# EasyEDA Pro project travellium-12v-desktop-power-supply-cc8d8467.epro, board LM5143_PCB
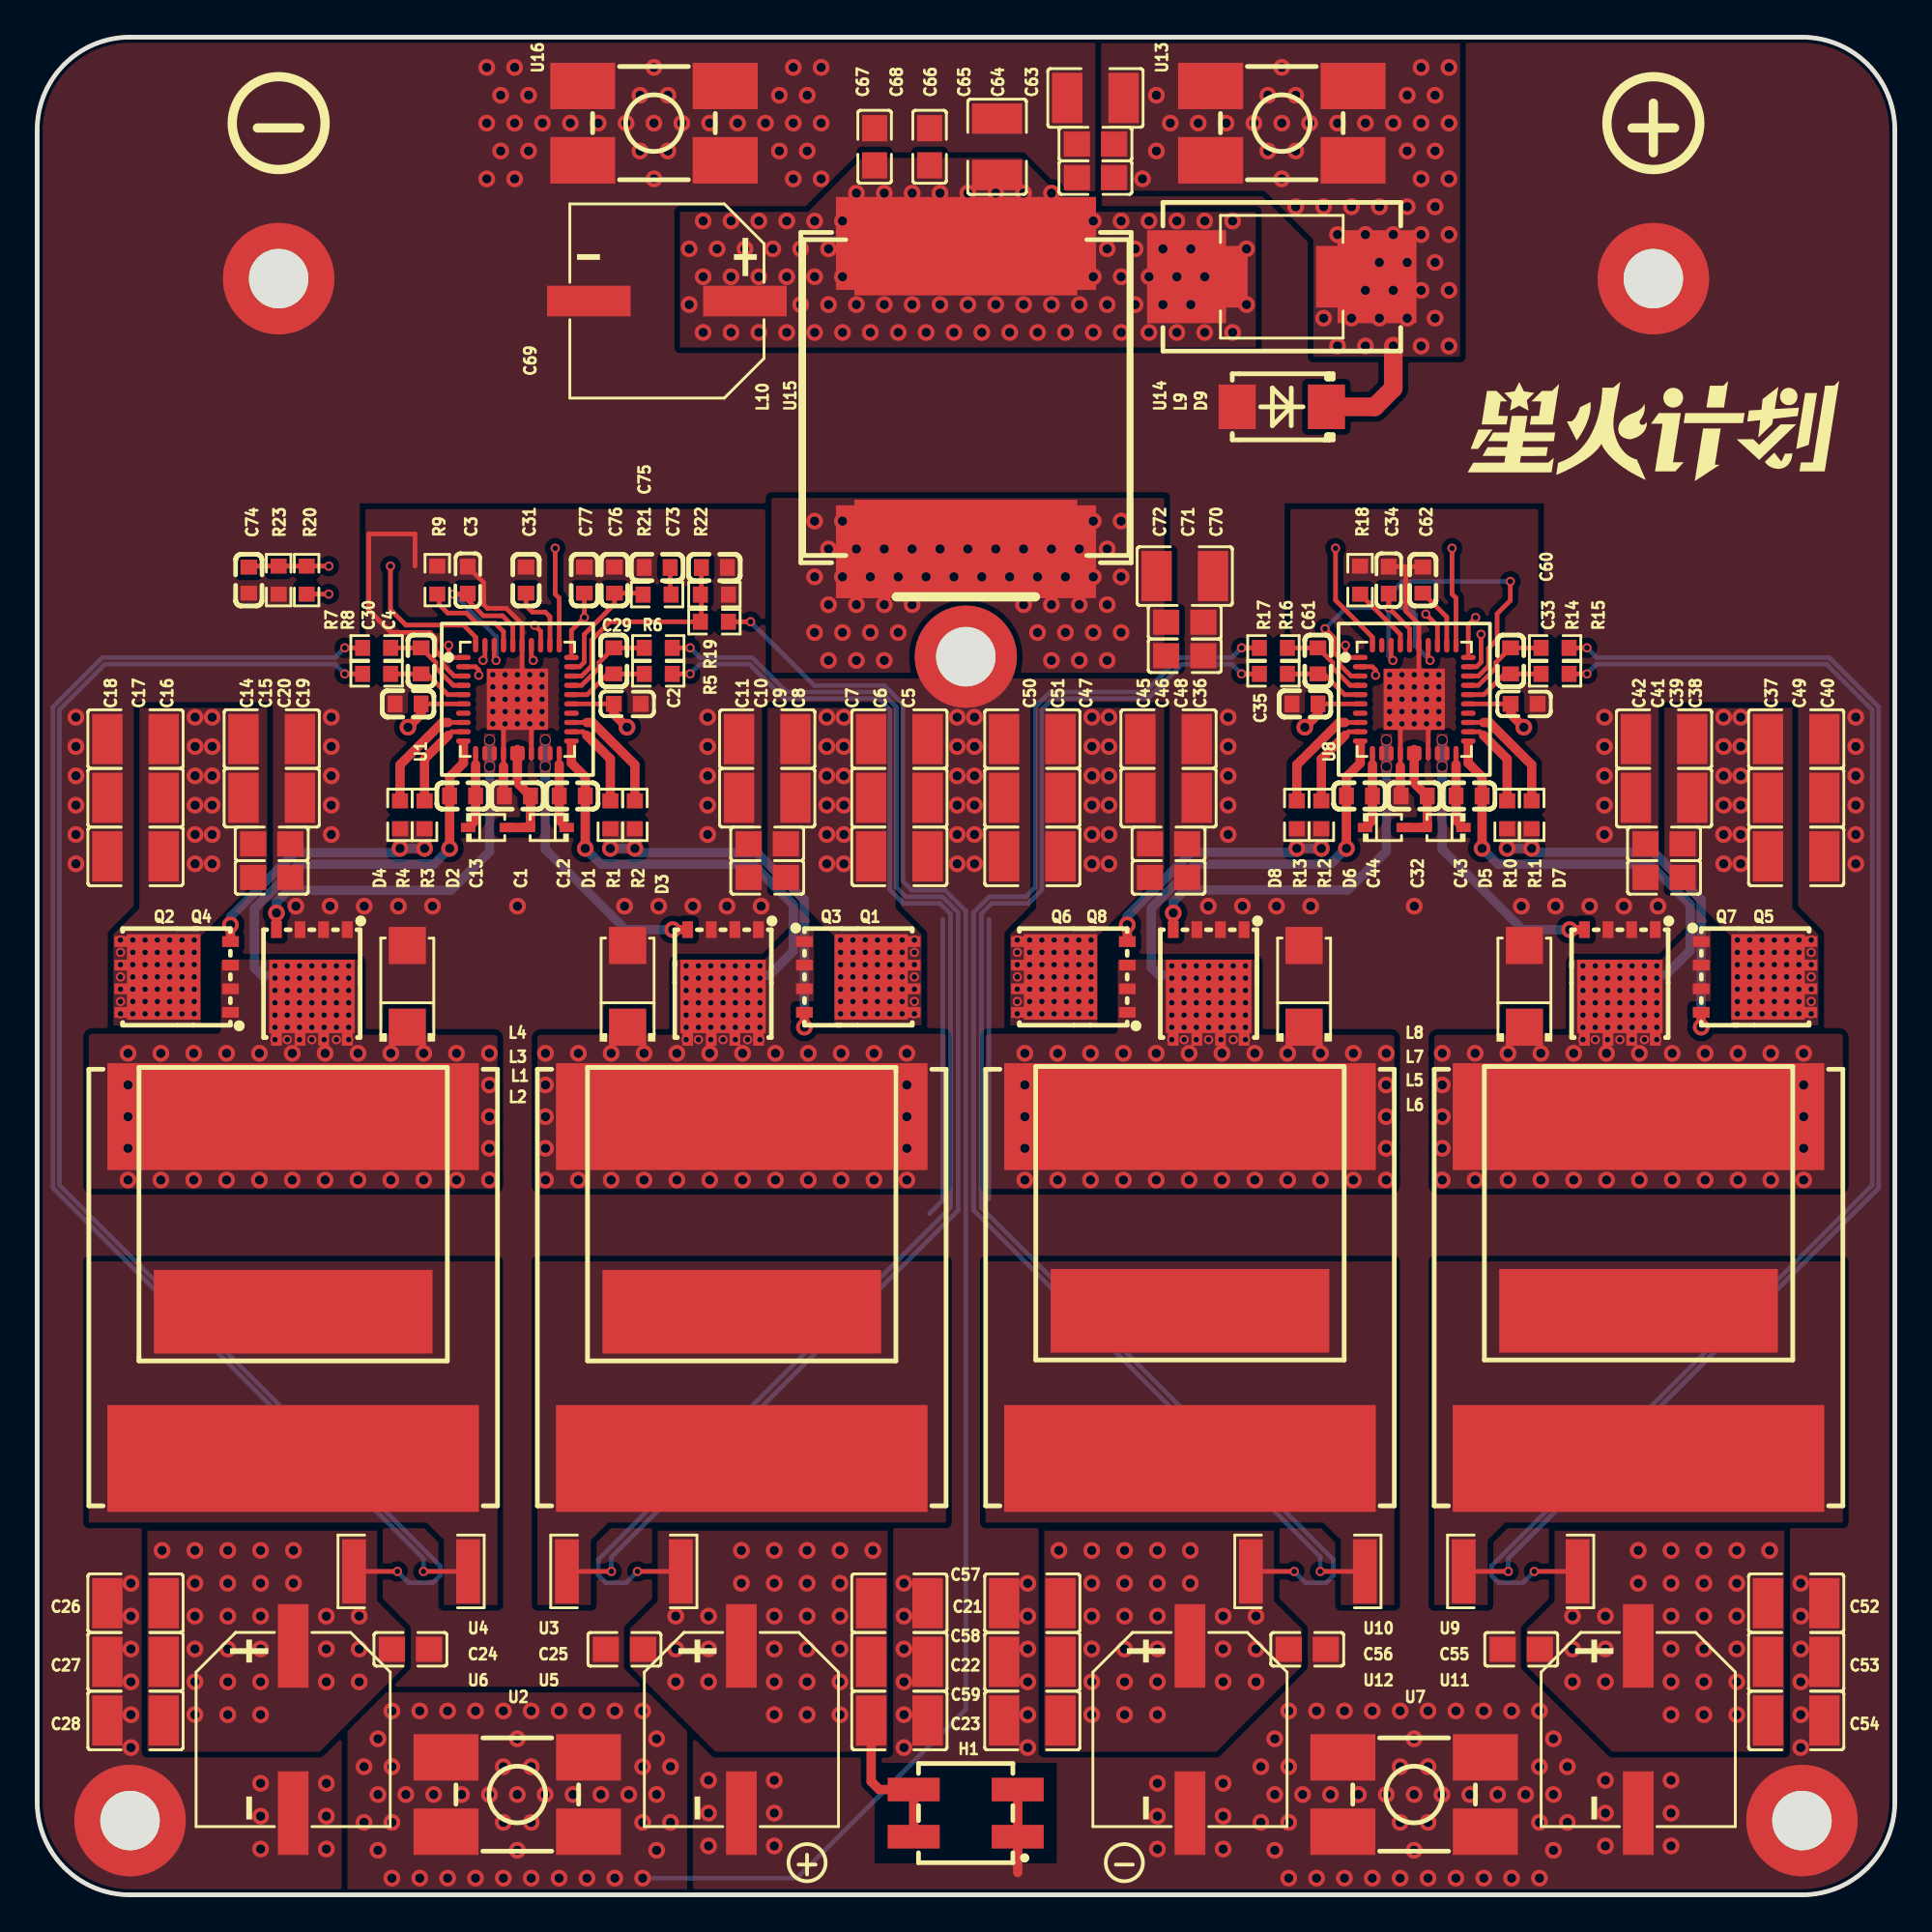
[diagram p7: board, top side]
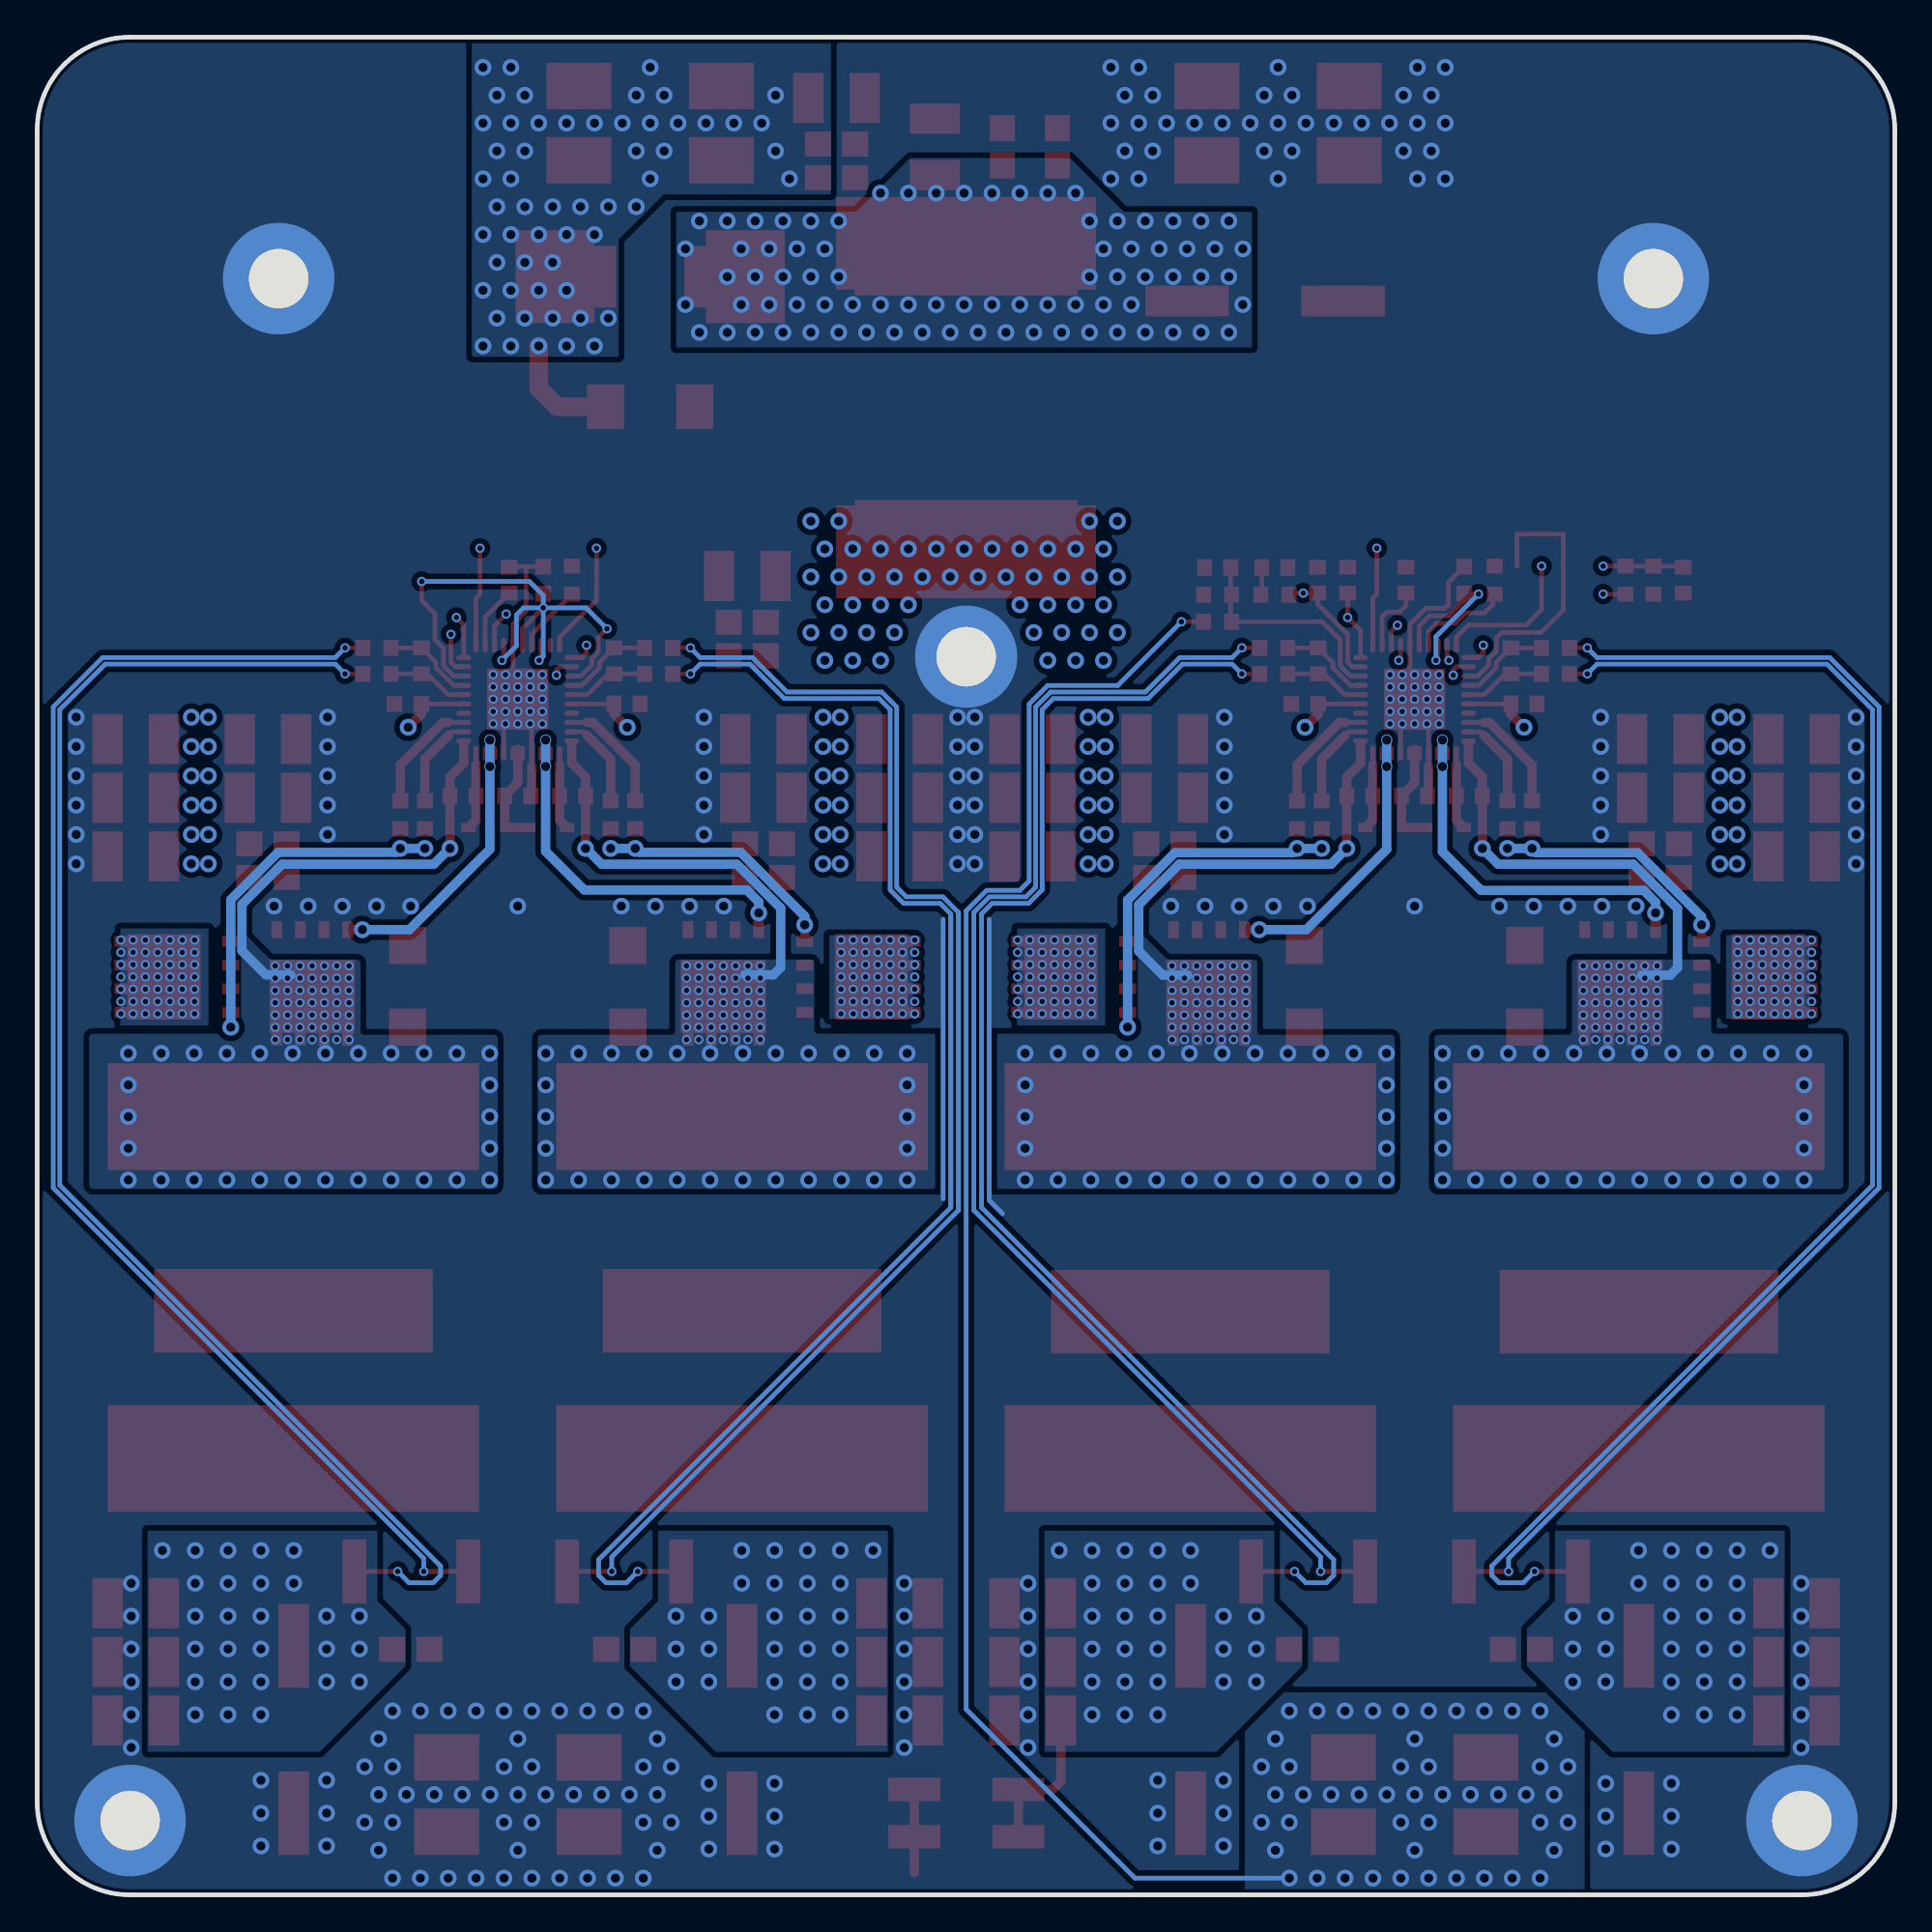
[diagram p8: board, bottom side, seen from below]

Outline 100 x 100 mm; copper layers: Top Layer, Inner1, Inner2, Inner3, Inner4, Bottom Layer. Coordinates in mm from the lower left corner of the outline.
Outline path: 0,95 0,5 arc(1.46,1.46) 5,0 95,0 arc(98.54,1.46) 100,5 100,95 arc(98.54,98.54) 95,100 5,100 arc(1.46,98.54) 0,95
Stack: Top Layer 0.035mm 外层铜厚1oz / Dielectric 2 0.0994mm 3313 RC57% 4.2mil / Inner1 0.0152mm 内层铜厚 / Dielectric3 0.55mm 0.55mm H/H No copper / Inner2 0.0152mm 内层铜厚 / Dielectric 3 0.1088mm 2116 RC54% 4.9mil / Inner3 0.0152mm 内层铜厚 / Dielectric4 0.55mm 0.55mm H/H No copper / Inner4 0.0152mm 内层铜厚 / Dielectric5 0.0994mm 3313 RC57% 4.2mil / Bottom Layer 0.035mm 外层铜厚1oz

## Design rules (mm)
spacing copperThickness1oz (default): track to track 0.1, other pairs 0.15 to 0.3
spacing copperThickness2oz: track to track 0.203, other pairs 0.152 to 0.3
spacing Plane_innerPlane: track to track 0.1, other pairs 0.15 to 0.3
spacing Copper_copperRegion: track to track 0.1, other pairs 0.15 to 0.3
track width copperThickness1oz: min 0.127, default 0.254, max 2.54
track width copperThickness2oz: min 0.203, default 0.254, max 2.54
track width Travellium (default): min 0.1, default 0.2, max 10
differential pair differentialPair (default): width min 0.127, default 0.254, max 2.54; gap min 0.152, default 0.152
pour e1865 uses Copper_copperRegion
pour e1867 uses Copper_copperRegion
pour e1869 uses Copper_copperRegion
pour e1871 uses Copper_copperRegion
pour e1873 uses Copper_copperRegion
pour e1877 uses Copper_copperRegion
pour e1879 uses Copper_copperRegion
pour e1881 uses Copper_copperRegion
pour e1883 uses Copper_copperRegion
pour e1885 uses Copper_copperRegion
pour e1887 uses Copper_copperRegion
pour e1889 uses Copper_copperRegion
pour e1891 uses Copper_copperRegion
pour e1905 uses Copper_copperRegion
pour e1907 uses Copper_copperRegion
pour e1909 uses Copper_copperRegion
pour e1911 uses Copper_copperRegion
pour e1913 uses Copper_copperRegion
pour e1915 uses Copper_copperRegion

## Placement (name value [footprint] x y rotation side)
C1  4.7uF  [C0603]  25.85 59.15 180 top
C2  470nF  [CAP-SMD_L1.6-W0.8-3]  31.77 64.11 180 top
C3  470nF  [CAP-SMD_L1.6-W0.8-3]  23.18 70.77 270 top
C4  2.2uF  [C0603]  19.97 64.11 180 top
C5  10uF  [C1210]  46.41 62.21 180 top
C6  10uF  [C1210]  46.41 59.06 180 top
C7  10uF  [C1210]  46.41 55.9 180 top
C8  10uF  [C1210]  39.3 62.21 0 top
C9  10uF  [C1210]  39.3 59.06 0 top
C10  100nF  [C0805]  39.3 56.58 0 top
C11  10nF  [C0805]  39.3 54.77 180 top
C12  100nF  [C0603]  28.8 59.15 180 top
C13  100nF  [C0603]  22.9 59.15 0 top
C14  10nF  [C0805]  12.63 54.77 0 top
C15  100nF  [C0805]  12.63 56.58 180 top
C16  10uF  [C1210]  5.29 62.21 0 top
C17  10uF  [C1210]  5.29 59.06 0 top
C18  10uF  [C1210]  5.29 55.9 0 top
C19  10uF  [C1210]  12.63 62.21 180 top
C20  10uF  [C1210]  12.63 59.06 180 top
C21  22uF  [C1210]  46.41 15.7 180 top
C22  22uF  [C1210]  46.41 12.54 180 top
C23  22uF  [C1210]  46.41 9.39 180 top
C24  100nF  [C0805]  20.09 13.22 180 top
C25  100nF  [C0805]  31.61 13.22 0 top
C26  22uF  [C1210]  5.29 15.7 0 top
C27  22uF  [C1210]  5.29 12.54 0 top
C28  22uF  [C1210]  5.29 9.39 0 top
C29  33pF  [C0603]  31.04 66.43 270 top
C30  33pF  [C0603]  20.67 66.43 270 top
C31  2.2uF  [C0603]  26.32 70.77 270 top
C32  4.7uF  [C0603]  74.13 59.15 180 top
C33  470nF  [CAP-SMD_L1.6-W0.8-3]  80.04 64.11 180 top
C34  470nF  [CAP-SMD_L1.6-W0.8-3]  72.76 70.77 270 top
C35  2.2uF  [C0603]  68.25 64.11 180 top
C36  10uF  [C1210]  60.9 59.06 180 top
C37  10uF  [C1210]  94.69 55.9 180 top
C38  10uF  [C1210]  87.58 62.21 0 top
C39  10uF  [C1210]  87.58 59.06 0 top
C40  10uF  [C1210]  94.69 62.21 180 top
C41  100nF  [C0805]  87.58 56.58 0 top
C42  10nF  [C0805]  87.58 54.77 180 top
C43  100nF  [C0603]  77.08 59.15 180 top
C44  100nF  [C0603]  71.18 59.15 0 top
C45  10nF  [C0805]  60.9 54.77 0 top
C46  100nF  [C0805]  60.9 56.58 180 top
C47  10uF  [C1210]  53.57 62.21 0 top
C48  10uF  [C1210]  60.9 62.21 180 top
C49  10uF  [C1210]  94.69 59.06 180 top
C50  10uF  [C1210]  53.57 55.9 0 top
C51  10uF  [C1210]  53.57 59.06 0 top
C52  22uF  [C1210]  94.69 15.7 180 top
C53  22uF  [C1210]  94.69 12.54 180 top
C54  22uF  [C1210]  94.69 9.39 180 top
C55  100nF  [C0805]  79.89 13.22 0 top
C56  100nF  [C0805]  68.37 13.22 180 top
C57  22uF  [C1210]  53.57 15.7 0 top
C58  22uF  [C1210]  53.57 12.54 0 top
C59  22uF  [C1210]  53.57 9.39 0 top
C60  33pF  [C0603]  79.32 66.43 270 top
C61  33pF  [C0603]  68.94 66.43 270 top
C62  2.2uF  [C0603]  74.59 70.77 270 top
C63  10uF  [C1210]  56.97 96.73 0 top
C64  100nF  [C0805]  56.97 92.44 0 top
C65  10nF  [C0805]  56.97 94.25 180 top
C66  10uF  [C1210]  51.67 94.1 270 top
C67  100nF  [C0805]  45.08 94.1 270 top
C68  10nF  [C0805]  48.04 94.1 90 top
C69  56uF  [CAP-SMD_BD10.0-L10.3-W10.3-LS11.0-FD-1]  33.9 85.8 180 top
C70  10uF  [C1210]  61.78 70.99 180 top
C71  100nF  [C0805]  61.78 68.51 180 top
C72  10nF  [C0805]  61.78 66.7 0 top
C73  6.8pF  [C0603]  36.46 71.45 180 top
C74  33pF  [C0603]  11.39 70.77 90 top
C75  47nF  [C0603]  33.38 71.45 0 top
C76  220pF  [C0603]  31.08 70.77 270 top
C77  330nF  [C0603]  29.46 70.77 270 top
D1  B5819WS  [SOD-323_L1.7-W1.3-LS2.5-FD]  27.46 57.45 0 top
D2  B5819WS  [SOD-323_L1.7-W1.3-LS2.5-FD]  24.24 57.45 180 top
D3  SS56  [SMA_L4.3-W2.6-LS5.2-RD]  31.78 48.9 90 top
D4  SS56  [SMA_L4.3-W2.6-LS5.2-RD]  19.92 48.9 90 top
D5  B5819WS  [SOD-323_L1.7-W1.3-LS2.5-FD]  75.74 57.45 0 top
D6  B5819WS  [SOD-323_L1.7-W1.3-LS2.5-FD]  72.52 57.45 180 top
D7  SS56  [SMA_L4.3-W2.6-LS5.2-RD]  80.06 48.9 90 top
D8  SS56  [SMA_L4.3-W2.6-LS5.2-RD]  68.2 48.9 90 top
D9  SMBJ58A  [SMB_L4.4-W3.6-LS5.3-RD]  67 80.1 180 top
H1  X6521WVS-2x02H-C60D74  [HDR-SMD_4P-P2.54-V-M-R2-C5-S7.4]  49.98 4.4 90 top
L1  6.8uH  [IND-SMD_L16.5-W15.5]  37.93 36.64 270 top
L2  6.8uH  [IND-SMD_L16.5-W15.5]  13.78 36.64 90 top
L3  6.8uH  [IND-SMD_L23.5-W22.0]  37.93 32.69 270 top
L4  6.8uH  [IND-SMD_L23.5-W22.0]  13.78 32.69 270 top
L5  6.8uH  [IND-SMD_L16.5-W15.5]  86.2 36.69 270 top
L6  6.8uH  [IND-SMD_L16.5-W15.5]  62.06 36.69 90 top
L7  6.8uH  [IND-SMD_L23.5-W22.0]  86.2 32.69 270 top
L8  6.8uH  [IND-SMD_L23.5-W22.0]  62.06 32.69 270 top
L9  150nH  [IND-SMD_L12.8-W8.0_FPIB130840]  67 87.1 180 top
L10  1.5uH  [IND-SMD_L17.5-W17.5]  50 80.6 270 top
NOREF  -  [Pad_e1223]  49.99 66.65 180 top
NOREF#2  -  [Pad_e1227]  95 4 0 top
NOREF#3  -  [Pad_e1224]  13 87 0 top
NOREF#4  -  [Pad_e1225]  87 87 180 top
NOREF#5  -  [Pad_e1226]  5 4 0 top
Q1  CSD18563Q5A  [DFN-8_L5.7-W5.1-P1.27-LS6.0-BL]  44.2 49.41 270 top
Q2  CSD18563Q5A  [DFN-8_L5.7-W5.1-P1.27-LS6.0-BL]  7.51 49.41 90 top
Q3  CSD18563Q5A  [DFN-8_L5.7-W5.1-P1.27-LS6.0-BL]  36.92 49.06 180 top
Q4  CSD18563Q5A  [DFN-8_L5.7-W5.1-P1.27-LS6.0-BL]  14.79 49.06 180 top
Q5  CSD18563Q5A  [DFN-8_L5.7-W5.1-P1.27-LS6.0-BL]  92.48 49.41 270 top
Q6  CSD18563Q5A  [DFN-8_L5.7-W5.1-P1.27-LS6.0-BL]  55.78 49.41 90 top
Q7  CSD18563Q5A  [DFN-8_L5.7-W5.1-P1.27-LS6.0-BL]  85.2 49.06 180 top
Q8  CSD18563Q5A  [DFN-8_L5.7-W5.1-P1.27-LS6.0-BL]  63.06 49.06 180 top
R1  4.7Ω  [R0603]  30.85 58.14 90 top
R2  4.7Ω  [R0603]  32.18 58.14 90 top
R3  4.7Ω  [R0603]  20.85 58.14 270 top
R4  4.7Ω  [R0603]  19.53 58.14 270 top
R5  0Ω  [R0603]  33.44 65.73 0 top
R6  49.9Ω  [R0603]  33.44 67.13 0 top
R7  49.9Ω  [R0603]  18.27 67.13 180 top
R8  0Ω  [R0603]  18.27 65.73 180 top
R9  110kΩ  [R0603]  21.54 70.77 270 top
R10  4.7Ω  [R0603]  79.13 58.14 90 top
R11  4.7Ω  [R0603]  80.45 58.14 90 top
R12  4.7Ω  [R0603]  69.13 58.14 270 top
R13  4.7Ω  [R0603]  67.81 58.14 270 top
R14  0Ω  [R0603]  81.71 65.73 0 top
R15  49.9Ω  [R0603]  81.71 67.13 0 top
R16  49.9Ω  [R0603]  66.55 67.13 180 top
R17  0Ω  [R0603]  66.55 65.73 180 top
R18  110kΩ  [R0603]  71.21 70.77 270 top
R19  130kΩ  [R0603]  36.46 68.53 0 top
R20  220kΩ  [R0603]  14.51 70.77 270 top
R21  33kΩ  [R0603]  33.37 69.99 180 top
R22  6.8kΩ  [R0603]  36.46 69.99 180 top
R23  18kΩ  [R0603]  13 70.77 90 top
U1  LM5143QRHARQ1  [VQFN-40_L6.0-W6.0-P0.50-TL-EP3.3]  25.85 64.36 0 top
U2  TS34031  [CONN-SMD_TS34031]  25.85 5.4 0 top
U3  3mΩ  [R2512]  31.58 17.41 180 top
U4  3mΩ  [R2512]  20.13 17.41 180 top
U5  330uF  [CAP-SMD_BD10.0-L10.3-W10.3-LS10.9-FD]  37.91 8.9 270 top
U6  330uF  [CAP-SMD_BD10.0-L10.3-W10.3-LS10.9-FD]  13.78 8.9 270 top
U7  TS34031  [CONN-SMD_TS34031]  74.12 5.4 0 top
U8  LM5143QRHARQ1  [VQFN-40_L6.0-W6.0-P0.50-TL-EP3.3]  74.13 64.36 0 top
U9  3mΩ  [R2512]  79.86 17.41 180 top
U10  3mΩ  [R2512]  68.4 17.41 180 top
U11  330uF  [CAP-SMD_BD10.0-L10.3-W10.3-LS10.9-FD]  86.19 8.9 270 top
U12  330uF  [CAP-SMD_BD10.0-L10.3-W10.3-LS10.9-FD]  62.06 8.9 270 top
U13  TS34031  [CONN-SMD_TS34031]  67 95.37 0 top
U14  100nH  [IND-SMD_L7.1-W6.6]  67 87.1 180 top
U15  1uH  [IND-SMD_L17.5-W17.0_YXMAC1770]  49.99 80.6 270 top
U16  TS34031  [CONN-SMD_TS34031]  33.2 95.37 0 top

## Footprints (pads in the part's own frame, mm; a bottom-side part is the same pattern mirrored in y, then rotated)
C0603
  rect 0.8x0.9 smd: 1(-0.7,0) 2(0.7,0)
C0805
  rect 1.41x1.35 smd: 1(-1,0) 2(1,0)
C1210
  rect 1.635x2.7 smd: 1(-1.518,0) 2(1.518,0)
CAP-SMD_BD10.0-L10.3-W10.3-LS10.9-FD
  rect 4.5x1.65 smd: 1(-4.5,0) 2(4.5,0)
CAP-SMD_BD10.0-L10.3-W10.3-LS11.0-FD-1
  rect 4.5x1.65 smd: 1(-4.2,0) 2(4.2,0)
CAP-SMD_L1.6-W0.8-3
  rect 0.85x0.85 smd: 1(-0.725,0) 2(0.725,0)
CONN-SMD_TS34031
  rect 3.5x2.5 smd: 1(-3.835,2) 2(-3.835,-2) 3(3.835,-2) 4(3.835,2)
DFN-8_L5.7-W5.1-P1.27-LS6.0-BL
  rect 0.58x0.9 smd: 1(1.905,-2.9) 2(-1.905,-2.9) 2(-0.635,-2.9) 2(0.635,-2.9) 3(-1.905,2.9) 3(-0.635,2.9) 3(0.635,2.9) 3(1.905,2.9)
  rect 4.6x3.95 smd: 3(0,0.695)
HDR-SMD_4P-P2.54-V-M-R2-C5-S7.4
  rect 1.27x2.8 smd: 1(-1.27,-2.8) 2(-1.27,2.8) 3(1.27,-2.8) 4(1.27,2.8)
IND-SMD_L7.1-W6.6
  rect 2.15x3.32 smd: 1(-2.913,0) 2(2.913,0)
IND-SMD_L12.8-W8.0_FPIB130840
  rect 4.25x5 smd: 1(-5.125,0) 2(5.125,0)
IND-SMD_L16.5-W15.5
  rect 4.5x15 smd: 1(5.25,0) 2(-5.25,0)
IND-SMD_L17.5-W17.0_YXMAC1770
  rect 5x12 smd: 1(-8,0) 2(8,0)
IND-SMD_L17.5-W17.5
  rect 5x14 smd: 1(-8.3,0) 2(8.3,0)
IND-SMD_L23.5-W22.0
  rect 5.75x20 smd: 1(-9.2,0) 2(9.2,0)
Pad_e1223
  round 5.5 hole 3.2: 1(0,0)
Pad_e1224
  round 6 hole 3.2: 1(0,0)
Pad_e1225
  round 6 hole 3.2: 1(0,0)
Pad_e1226
  round 6 hole 3.2: 1(0,0)
Pad_e1227
  round 6 hole 3.2: 1(0,0)
R0603
  rect 0.806x0.864 smd: 1(-0.753,0) 2(0.753,0)
R2512
  rect 1.282x3.456 smd: 1(-3.067,0) 2(3.067,0)
SMA_L4.3-W2.6-LS5.2-RD
  rect 2x2 smd: 1(-2.2,0) 2(2.2,0)
SMB_L4.4-W3.6-LS5.3-RD
  rect 2x2.4 smd: 1(-2.4,0) 2(2.4,0)
SOD-323_L1.7-W1.3-LS2.5-FD
  rect 0.78x0.5 smd: 1(-1.04,0) 2(1.04,0)
VQFN-40_L6.0-W6.0-P0.50-TL-EP3.3
  oval 0.79x0.28 smd: 1(-2.908,2.25) 2(-2.908,1.75) 3(-2.908,1.25) 4(-2.908,0.75) 5(-2.908,0.25) 6(-2.908,-0.25) 7(-2.908,-0.75) 8(-2.908,-1.25) 9(-2.908,-1.75) 10(-2.908,-2.25) 21(2.908,-2.25) 22(2.908,-1.75) 23(2.908,-1.25) 24(2.908,-0.75) 25(2.908,-0.25) 26(2.908,0.25) 27(2.908,0.75) 28(2.908,1.25) 29(2.908,1.75) 30(2.908,2.25)
  oval 0.28x0.79 smd: 11(-2.25,-2.908) 12(-1.75,-2.908) 13(-1.25,-2.908) 14(-0.75,-2.908) 15(-0.25,-2.908) 16(0.25,-2.908) 17(0.75,-2.908) 18(1.25,-2.908) 19(1.75,-2.908) 20(2.25,-2.908) 31(2.25,2.908) 32(1.75,2.908) 33(1.25,2.908) 34(0.75,2.908) 35(0.25,2.908) 36(-0.25,2.908) 37(-0.75,2.908) 38(-1.25,2.908) 39(-1.75,2.908) 40(-2.25,2.908)
  rect 3.3x3.3 smd: 41(0,0)

## Nets
As in the schematic, except:
AGND1: C1.2 C2.1 C3.1 C4.2 C5.1 C6.1 C7.1 C8.1 C9.1 C10.1 C11.2 C14.2 C15.1 C16.1 C17.1 C18.1 C19.1 C20.1 C21.1 C22.1 C23.1 C24.1 C25.1 C26.1 C27.1 C28.1 C31.1 C32.2 C33.1 C34.1 C35.2 C36.1 C37.1 C38.1 C39.1 C40.1 C41.1 C42.2 C45.2 C46.1 C47.1 C48.1 C49.1 C50.1 C51.1 C52.1 C53.1 C54.1 C55.1 C56.1 C57.1 C58.1 C59.1 C62.1 C63.1 C64.1 C65.2 C66.1 C67.1 C68.2 C69.2 C70.1 C71.1 C72.2 C73.1 C74.1 C75.1 C76.1 C77.1 D3.2 D4.2 D7.2 D8.2 D9.2 H1.1 H1.3 NOREF.1 NOREF#2.1 NOREF#3.1 NOREF#4.1 NOREF#5.1 Q3.2 Q4.2 Q7.2 Q8.2 R9.1 R18.1 R22.1 R23.1 U1.3 U1.14 U1.17 U1.35 U1.41 U5.2 U6.2 U7.1 U7.2 U7.3 U7.4 U8.14 U8.17 U8.35 U8.41 U11.2 U12.2 U16.1 U16.2 U16.3 U16.4

Pads without a net: U1 7 24; U8 7 24 39

## Via types
v1: diameter 0.5, hole 0.3, Top Layer to Bottom Layer, 484 vias
v2: diameter 0.9, hole 0.5, Top Layer to Bottom Layer, 730 vias
v3: diameter 0.6, hole 0.5, Top Layer to Bottom Layer, 8 vias

## Routing (per net, layer and track width the routed paths; a pad name or vN(x,y) marks a point on that pad's centre or on a via; arc(x,y) is an arc through that point)
AGND1: length 78.3
  Top Layer w0.25: 74.51,65.5 74.38,65.63 U8.35 74.38,68.4 73.68,69.1 73.68,71.5 ; 25.1,60.75 U1.14 25.1,62.95 v1(25.19,63.03) ; v1(73.47,63.03) 73.38,62.95 U8.14 73.38,60.75 ; 20.34,71.53 20.34,73.25 17.85,73.25 17.85,69.15 19.05,67.95 21.15,67.95 21.45,67.65 21.45,66.95 21.85,66.55 21.85,66.21 22.45,65.61 U1.3 ; v1(26.52,63.03) 26.6,62.95 U1.17 ; 73.68,71.5 C34.1 ; 73.68,71.5 74.57,71.5 74.59,71.47 ; 26.23,65.5 26.1,65.63 U1.35 26.1,68.4 25.25,69.25 24.24,69.25 24.04,69.45 24.04,70.64 C3.1 ; v1(74.79,63.03) 74.88,62.95 U8.17
  Top Layer w0.5: 52.78,1.2 H1.1 H1.3 ; 25.1,60.75 25.1,59.2 C1.2 ; C32.2 73.38,59.2 73.38,60.75
  Bottom Layer w0.25: 51.23,37.47 51.23,52.52 ; 48.75,52.52 48.75,37.39 48.04,36.68
  vias: v1(24.53,65.68) v1(24.53,65.02) v1(24.53,64.36) v1(24.53,63.7) v1(24.53,63.03) v1(25.19,65.68) v1(25.19,65.02) v1(25.19,64.36) v1(25.19,63.7) v1(25.85,65.68) v1(25.85,65.02) v1(25.85,64.36) v1(25.85,63.7) v1(25.85,63.03) v1(26.52,65.68) v1(26.52,65.02) v1(26.52,64.36) v1(26.52,63.7) v1(27.18,65.68) v1(27.18,65.02) v1(27.18,64.36) v1(27.18,63.7) v1(27.18,63.03) v1(72.81,65.68) v1(72.81,65.02) v1(72.81,64.36) v1(72.81,63.7) v1(72.81,63.03) v1(73.47,65.68) v1(73.47,65.02) v1(73.47,64.36) v1(73.47,63.7) v1(74.13,65.68) v1(74.13,65.02) v1(74.13,64.36) v1(74.13,63.7) v1(74.13,63.03) v1(74.79,65.68) v1(74.79,65.02) v1(74.79,64.36) v1(74.79,63.7) v1(75.45,65.68) v1(75.45,65.02) v1(75.45,64.36) v1(75.45,63.7) v1(75.45,63.03) v2(2.09,63.39) v2(2.09,61.81) v2(2.09,60.24) v2(2.09,58.66) v2(2.09,57.08) v2(2.09,55.5) v2(5.05,16.77) v2(5.05,15) v2(5.05,13.23) v2(5.05,11.47) v2(5.05,9.7) v2(5.05,7.93) v2(12.03,6) v2(12.03,4.23) v2(12.03,2.47) v2(13.93,53.22) v2(15.57,6) v2(15.57,4.23) v2(15.57,2.47) v2(15.83,63.39) v2(15.83,61.81) v2(15.83,60.24) v2(15.83,58.66) v2(15.83,57.08) v2(15.77,53.22) v2(17.61,53.22) v2(19.44,53.22) v2(21.28,53.22) v2(24.2,98.37) v2(24.2,95.37) v2(24.2,92.37) v2(24.95,96.87) v2(24.95,93.87) v2(25.7,98.37) v2(25.7,95.37) v2(25.7,92.37) v2(25.85,53.22) v2(26.45,96.87) v2(26.45,93.87) v2(27.2,95.37) v2(28.7,95.37) v2(30.2,95.37) v2(31.62,53.22) v2(31.7,95.37) v2(32.45,96.87) v2(32.45,93.87) v2(33.2,98.37) v2(33.2,95.37) v2(33.2,92.37) v2(33.46,53.22) v2(33.95,96.87) v2(33.95,93.87) v2(34.7,95.37) v2(35.3,53.22) v2(36.09,63.39) v2(36.09,61.81) v2(36.09,60.24) v2(36.09,58.66) v2(36.09,57.08) v2(36.14,6.17) v2(36.14,4.4) v2(36.14,2.63) v2(36.2,95.37) v2(37.13,53.22) v2(37.7,95.37) v2(38.97,53.22) v2(39.2,95.37) v2(39.68,6.17) v2(39.68,4.4) v2(39.68,2.63) v2(39.95,96.87) v2(39.95,93.87) v2(40.7,98.37) v2(40.7,95.37) v2(40.7,92.37) v2(41.45,96.87) v2(41.45,93.87) v2(42.2,98.37) v2(42.2,95.37) v2(42.2,92.37) v2(46.66,16.77) v2(46.66,15) v2(46.66,13.23) v2(46.66,11.47) v2(46.66,9.7) v2(46.66,7.93) v2(49.53,63.39) v2(49.53,61.81) v2(49.53,60.24) v2(49.53,58.66) v2(49.53,57.08) v2(49.53,55.5) v2(50.46,63.39) v2(50.46,61.81) v2(50.46,60.24) v2(50.46,58.66) v2(50.46,57.08) v2(50.46,55.5) v2(53.32,16.77) v2(53.32,15) v2(53.32,13.23) v2(53.32,11.47) v2(53.32,9.7) v2(53.32,7.93) v2(60.3,6) v2(60.3,4.23) v2(60.3,2.47) v2(63.04,53.22) v2(63.84,6) v2(63.84,4.23) v2(63.84,2.47) v2(64.11,63.39) v2(64.11,61.81) v2(64.11,60.24) v2(64.11,58.66) v2(64.11,57.08) v2(64.88,53.22) v2(65.87,6.9) v2(65.87,3.9) v2(66.62,8.4) v2(66.62,5.4) v2(66.62,2.4) v2(66.72,53.22) v2(67.37,9.9) v2(67.37,6.9) v2(67.37,3.9) v2(67.37,0.9) v2(68.12,5.4) v2(68.56,53.22) v2(68.87,9.9) v2(68.87,0.9) v2(69.62,5.4) v2(70.37,9.9) v2(70.37,0.9) v2(71.12,5.4) v2(71.87,9.9) v2(71.87,0.9) v2(72.62,5.4) v2(73.37,9.9) v2(73.37,6.9) v2(73.37,3.9) v2(73.37,0.9) v2(74.13,53.22) v2(74.12,8.4) v2(74.12,5.4) v2(74.12,2.4) v2(74.87,9.9) v2(74.87,6.9) v2(74.87,3.9) v2(74.87,0.9) v2(75.62,5.4) v2(76.37,9.9) v2(76.37,0.9) v2(77.12,5.4) v2(77.87,9.9) v2(77.87,0.9) v2(78.62,5.4) v2(79.37,9.9) v2(79.37,0.9) v2(79.9,53.22) v2(80.12,5.4) v2(80.87,9.9) v2(80.87,6.9) v2(80.87,3.9) v2(80.87,0.9) v2(81.62,8.4) v2(81.62,5.4) v2(81.62,2.4) v2(81.73,53.22) v2(82.37,6.9) v2(82.37,3.9) v2(83.57,53.22) v2(84.37,63.39) v2(84.37,61.81) v2(84.37,60.24) v2(84.37,58.66) v2(84.37,57.08) v2(84.42,6.17) v2(84.42,4.4) v2(84.42,2.63) v2(85.41,53.22) v2(87.25,53.22) v2(87.95,6.17) v2(87.95,4.4) v2(87.95,2.63) v2(94.94,16.77) v2(94.94,15) v2(94.94,13.23) v2(94.94,11.47) v2(94.94,9.7) v2(94.94,7.93) v2(97.9,63.39) v2(97.9,61.81) v2(97.9,60.24) v2(97.9,58.66) v2(97.9,57.08) v2(97.9,55.5)
P5V: length 72.4
  Top Layer w0.25: C4.1 U1.6 ; 68.94,64.11 U8.6
  Top Layer w0.5: v2(68.24,62.85) 68.95,63.56 C35.1 ; v2(19.96,62.85) 20.67,63.56 20.67,64.11
  Inner4 w0.5: v2(19.96,62.85) 23.32,59.5 28.2,59.5 29.1,60.4 29.1,63.2 41.2,75.3 58.8,75.3 68.24,65.86 v2(68.24,62.85)
VCC1: length 5.7
  Top Layer w0.5: 25.85,61.65 25.85,59.88 25.96,59.77 25.96,59.75 C1.1 26.55,57.58 D1.1 25.28,57.45
VCC2: length 5.7
  Top Layer w0.5: D6.1 D5.1 74.83,57.58 C32.1 74.23,59.75 74.23,59.77 74.13,59.88 74.13,61.65
VDDA1: length 19.6
  Top Layer w0.25: v1(24.7,66.45) 24.6,66.55 U1.38 ; U1.34 26.6,66.55 v1(26.7,66.45) ; U1.33 27.1,68.02 v1(26.78,68.34) ; U1.36 25.6,68.3 25.05,68.85 24.02,68.85 23.18,69.69 C3.2 23.15,70.02 v1(22.41,70.02)
  Inner3 w0.5: v1(26.7,66.45) 26.78,66.53 v1(26.78,68.34) 25.1,70.02 v1(22.41,70.02)
  Bottom Layer w0.25: v1(24.7,66.45) 24.7,67.73 v1(22.41,70.02)
VDDA2: length 33.6
  Top Layer w0.25: v1(72.98,66.45) 72.88,66.55 U8.38 ; U8.3 70.73,65.61 70.13,66.21 70.13,66.55 69.8,66.88 69.8,67.68 v1(69.33,68.15) ; U8.28 77.58,65.61 78.13,66.15 78.13,67.11 78.59,67.57 78.59,68.96 79.3,69.67 v1(79.3,70.7) ; C34.2 v1(72.76,69.28) 73.88,68.16 U8.36 ; v1(74.98,66.45) 74.88,66.55 U8.34
  Bottom Layer w0.25: v1(72.76,69.28) 72.76,69.96 73.5,70.7 v1(79.3,70.7) ; v1(72.76,69.28) 70.45,69.28 v1(69.33,68.15) ; v1(72.76,69.28) 72.76,66.68 v1(72.98,66.45) ; v1(72.76,69.28) 73.82,69.28 74.2,68.9 74.2,67.23 v1(74.98,66.45)
VIN: length 43.3
  Top Layer w0.25: U8.25 C33.2 ; 14.51,70.02 v1(15.7,70.02) ; U1.25 C2.2
  Top Layer w0.5: C2.2 31.04,63.56 v2(31.75,62.85) ; C33.2 79.32,63.56 v2(80.03,62.85)
  Inner4 w0.5: v2(31.75,62.85) 33.6,64.7 41.2,64.7 v2(42.51,63.39) ; v2(90.78,63.39) 89.48,64.7 81.87,64.7 v2(80.03,62.85) ; v2(9.42,63.39) 9.42,65.62 13.82,70.02 v1(15.7,70.02)
  vias: v1(4.49,51.4) v1(4.49,50.74) v1(4.49,50.07) v1(4.49,49.41) v1(4.49,48.75) v1(4.49,48.09) v1(4.49,47.43) v1(5.15,51.4) v1(5.15,50.74) v1(5.15,50.07) v1(5.15,49.41) v1(5.15,48.75) v1(5.15,48.09) v1(5.15,47.43) v1(5.81,51.4) v1(5.81,50.74) v1(5.81,50.07) v1(5.81,49.41) v1(5.81,48.75) v1(5.81,48.09) v1(5.81,47.43) v1(6.47,51.4) v1(6.47,50.74) v1(6.47,50.07) v1(6.47,49.41) v1(6.47,48.75) v1(6.47,48.09) v1(6.47,47.43) v1(7.13,51.4) v1(7.13,50.74) v1(7.13,50.07) v1(7.13,49.41) v1(7.13,48.75) v1(7.13,48.09) v1(7.13,47.43) v1(7.8,51.4) v1(7.8,50.74) v1(7.8,50.07) v1(7.8,49.41) v1(7.8,48.75) v1(7.8,48.09) v1(7.8,47.43) v1(8.46,51.4) v1(8.46,50.74) v1(8.46,50.07) v1(8.46,49.41) v1(8.46,48.75) v1(8.46,48.09) v1(8.46,47.43) v1(43.25,51.4) v1(43.25,50.74) v1(43.25,50.07) v1(43.25,49.41) v1(43.25,48.75) v1(43.25,48.09) v1(43.25,47.43) v1(43.91,51.4) v1(43.91,50.74) v1(43.91,50.07) v1(43.91,49.41) v1(43.91,48.75) v1(43.91,48.09) v1(43.91,47.43) v1(44.57,51.4) v1(44.57,50.74) v1(44.57,50.07) v1(44.57,49.41) v1(44.57,48.75) v1(44.57,48.09) v1(44.57,47.43) v1(45.24,51.4) v1(45.24,50.74) v1(45.24,50.07) v1(45.24,49.41) v1(45.24,48.75) v1(45.24,48.09) v1(45.24,47.43) v1(45.9,51.4) v1(45.9,50.74) v1(45.9,50.07) v1(45.9,49.41) v1(45.9,48.75) v1(45.9,48.09) v1(45.9,47.43) v1(46.56,51.4) v1(46.56,50.74) v1(46.56,50.07) v1(46.56,49.41) v1(46.56,48.75) v1(46.56,48.09) v1(46.56,47.43) v1(47.22,51.4) v1(47.22,50.74) v1(47.22,50.07) v1(47.22,49.41) v1(47.22,48.75) v1(47.22,48.09) v1(47.22,47.43) v1(52.76,51.4) v1(52.76,50.74) v1(52.76,50.07) v1(52.76,49.41) v1(52.76,48.75) v1(52.76,48.09) v1(52.76,47.43) v1(53.42,51.4) v1(53.42,50.74) v1(53.42,50.07) v1(53.42,49.41) v1(53.42,48.75) v1(53.42,48.09) v1(53.42,47.43) v1(54.09,51.4) v1(54.09,50.74) v1(54.09,50.07) v1(54.09,49.41) v1(54.09,48.75) v1(54.09,48.09) v1(54.09,47.43) v1(54.75,51.4) v1(54.75,50.74) v1(54.75,50.07) v1(54.75,49.41) v1(54.75,48.75) v1(54.75,48.09) v1(54.75,47.43) v1(55.41,51.4) v1(55.41,50.74) v1(55.41,50.07) v1(55.41,49.41) v1(55.41,48.75) v1(55.41,48.09) v1(55.41,47.43) v1(56.07,51.4) v1(56.07,50.74) v1(56.07,50.07) v1(56.07,49.41) v1(56.07,48.75) v1(56.07,48.09) v1(56.07,47.43) v1(56.73,51.4) v1(56.73,50.74) v1(56.73,50.07) v1(56.73,49.41) v1(56.73,48.75) v1(56.73,48.09) v1(56.73,47.43) v1(91.53,51.4) v1(91.53,50.74) v1(91.53,50.07) v1(91.53,49.41) v1(91.53,48.75) v1(91.53,48.09) v1(91.53,47.43) v1(92.19,51.4) v1(92.19,50.74) v1(92.19,50.07) v1(92.19,49.41) v1(92.19,48.75) v1(92.19,48.09) v1(92.19,47.43) v1(92.85,51.4) v1(92.85,50.74) v1(92.85,50.07) v1(92.85,49.41) v1(92.85,48.75) v1(92.85,48.09) v1(92.85,47.43) v1(93.51,51.4) v1(93.51,50.74) v1(93.51,50.07) v1(93.51,49.41) v1(93.51,48.75) v1(93.51,48.09) v1(93.51,47.43) v1(94.17,51.4) v1(94.17,50.74) v1(94.17,50.07) v1(94.17,49.41) v1(94.17,48.75) v1(94.17,48.09) v1(94.17,47.43) v1(94.84,51.4) v1(94.84,50.74) v1(94.84,50.07) v1(94.84,49.41) v1(94.84,48.75) v1(94.84,48.09) v1(94.84,47.43) v1(95.5,51.4) v1(95.5,50.74) v1(95.5,50.07) v1(95.5,49.41) v1(95.5,48.75) v1(95.5,48.09) v1(95.5,47.43) v2(8.5,63.39) v2(8.5,61.81) v2(8.5,60.24) v2(8.5,58.66) v2(8.5,57.08) v2(8.5,55.5) v2(9.42,61.81) v2(9.42,60.24) v2(9.42,58.66) v2(9.42,57.08) v2(9.42,55.5) v2(41.85,73.95) v2(41.85,70.95) v2(41.85,67.95) v2(42.51,61.81) v2(42.51,60.24) v2(42.51,58.66) v2(42.51,57.08) v2(42.51,55.5) v2(42.6,72.45) v2(42.6,69.45) v2(42.6,66.45) v2(43.35,73.95) v2(43.35,70.95) v2(43.35,67.95) v2(43.43,63.39) v2(43.43,61.81) v2(43.43,60.24) v2(43.43,58.66) v2(43.43,57.08) v2(43.43,55.5) v2(44.1,72.45) v2(44.1,69.45) v2(44.1,66.45) v2(44.85,70.95) v2(44.85,67.95) v2(45.6,72.45) v2(45.6,69.45) v2(45.6,66.45) v2(46.35,70.95) v2(46.35,67.95) v2(47.1,72.45) v2(47.1,69.45) v2(47.85,70.95) v2(48.6,72.45) v2(49.35,70.95) v2(50.1,72.45) v2(50.85,70.95) v2(51.6,72.45) v2(52.35,70.95) v2(53.1,72.45) v2(53.1,69.45) v2(53.85,70.95) v2(53.85,67.95) v2(54.6,72.45) v2(54.6,69.45) v2(54.6,66.45) v2(55.35,70.95) v2(55.35,67.95) v2(56.1,72.45) v2(56.1,69.45) v2(56.1,66.45) v2(56.85,73.95) v2(56.85,70.95) v2(56.85,67.95) v2(56.78,63.39) v2(56.78,61.81) v2(56.78,60.24) v2(56.78,58.66) v2(56.78,57.08) v2(56.78,55.5) v2(57.6,72.45) v2(57.6,69.45) v2(57.6,66.45) v2(57.7,63.39) v2(57.7,61.81) v2(57.7,60.24) v2(57.7,58.66) v2(57.7,57.08) v2(57.7,55.5) v2(58.35,73.95) v2(58.35,70.95) v2(58.35,67.95) v2(90.78,61.81) v2(90.78,60.24) v2(90.78,58.66) v2(90.78,57.08) v2(90.78,55.5) v2(91.7,63.39) v2(91.7,61.81) v2(91.7,60.24) v2(91.7,58.66) v2(91.7,57.08) v2(91.7,55.5)
COMP: length 85.9
  Top Layer w0.25: R21.2 32.54,70.07 v1(31.84,70.07) C76.2 31.08,69.48 29.45,67.85 29.45,66.35 29.21,66.11 U1.29 ; v1(77.73,67.85) 77.73,66.35 77.48,66.11 U8.29 ; v1(72.05,65.65) 72.05,65.93 71.87,66.11 U8.2 ; U1.2 23.6,66.11 23.77,65.93 v1(23.77,65.65)
  Inner4 w0.5: v1(23.77,65.65) 23.1,66.33 23.1,67.1 25,69 27.8,69 28.8,68 29.77,68 v1(31.84,70.07) 39.07,77.3 62.3,77.3 68.3,71.3 76.8,71.3 78.38,69.72 78.38,68.51 v1(77.73,67.85) 77.27,67.4 72.8,67.4 72.05,66.65 v1(72.05,65.65)
FB1: length 11.9
  Top Layer w0.25: U1.28 29.31,65.61 29.85,66.15 29.85,67.55 30.83,68.53 R19.1 35.76,68.58 C73.2
SS: length 74
  Top Layer w0.25: v1(77.43,68.76) 77.04,68.36 U8.30 ; v1(22.15,67.27) 22.15,66.85 22.4,66.61 U1.1 ; U8.1 70.67,66.61 70.43,66.85 v1(70.43,67.27) ; U1.30 28.76,68.06 v1(29.46,68.76) C77.2
  Inner3 w0.5: v1(29.46,68.76) 37.5,76.8 62,76.8 70.43,68.37 v1(70.43,67.27)
  Inner4 w0.5: v1(29.46,68.76) 28.42,69.8 24.69,69.8 v1(22.15,67.27) ; v1(77.43,68.76) 76.76,68.76 76.29,68.29 71.45,68.29 v1(70.43,67.27)
SYNC: length 61.6
  Top Layer w0.25: U8.33 75.38,68.32 v1(74.75,68.94) ; v1(24,66.45) 24.1,66.55 U1.39
  Inner4 w0.5: v1(24,66.45) 24,66.9 24.7,67.6 27.5,67.6 28,67.1 30.5,67.1 39.7,76.3 60.7,76.3 66.9,70.1 74.1,70.1 74.75,69.45 v1(74.75,68.94)
UVLO: length 94.6
  Top Layer w0.25: v1(19.02,71.53) 19.02,69.19 19.85,68.35 22.95,68.35 23.6,67.7 U1.40 ; v1(15.7,71.53) R20.1 R23.2 11.45,71.53 C74.2 ; U1.31 28.1,69.8 27.89,70.02 v1(27.89,72.49) ; U8.40 71.88,67.7 69.89,69.69 v1(69.89,72.49) ; U8.31 76.38,69.8 76.16,70.02 v1(76.16,72.49)
  Inner4 w0.5: v1(76.16,72.49) v1(69.89,72.49) 64.18,78.2 37.1,78.2 31.39,72.49 v1(27.89,72.49) 19.98,72.49 v1(19.02,71.53) v1(15.7,71.53)
VOUT: length 418.1
  Top Layer w0.25: R14.2 v1(83.43,65.73) ; v1(19.39,17.41) 16.99,17.41 ; v1(67.67,17.41) 65.27,17.41 ; R8.2 v1(16.56,65.73) ; R19.2 v1(38.4,68.53) ; v1(80.59,17.41) 82.99,17.41 ; v1(32.31,17.41) 34.71,17.41 ; R5.2 v1(35.15,65.73) ; R17.2 v1(64.83,65.73)
  Top Layer w0.5: C23.2 44.9,6.1 45.33,5.67 H1.4 H1.2
  Bottom Layer w0.25: v1(35.15,65.73) 35.68,66.25 38.35,66.25 40.2,64.4 45.3,64.4 45.9,63.8 45.9,54.1 46.63,53.37 48.59,53.37 49.16,52.8 49.16,37 30.21,18.04 30.21,17.2 30.61,16.8 31.7,16.8 v1(32.31,17.41) ; 50.82,37 50.82,52.8 51.39,53.37 53.36,53.37 54.08,54.1 54.08,63.8 54.68,64.4 59.78,64.4 61.64,66.25 64.31,66.25 v1(64.83,65.73) ; 50.82,37 50.82,52.66 ; 50.82,37 69.78,18.04 69.78,17.2 69.38,16.8 68.28,16.8 v1(67.67,17.41) ; v1(80.59,17.41) 79.98,16.8 78.68,16.8 78.28,17.2 78.28,17.7 98.78,38.2 98.78,63.8 96.33,66.25 83.95,66.25 v1(83.43,65.73) ; v1(19.39,17.41) 20,16.8 21.3,16.8 21.7,17.2 21.7,17.7 1.2,38.2 1.2,63.8 3.65,66.25 16.03,66.25 v1(16.56,65.73) ; v1(38.4,68.53) 41.84,65.1 45.6,65.1 46.6,64.1 46.6,54.57 47.1,54.07 48.88,54.07 49.99,52.97 49.99,9.99 40.9,0.9 v2(32.6,0.9)
  vias: v2(6.72,18.54) v2(8.49,18.54) v2(8.49,16.77) v2(8.49,15) v2(8.49,13.23) v2(8.49,11.47) v2(8.49,9.7) v2(10.26,18.54) v2(10.26,16.77) v2(10.26,15) v2(10.26,13.23) v2(10.26,11.47) v2(10.26,9.7) v2(12.03,18.54) v2(12.03,16.77) v2(12.03,15) v2(12.03,13.23) v2(12.03,11.47) v2(12.03,9.7) v2(13.8,18.54) v2(13.8,16.77) v2(15.57,15) v2(15.57,13.23) v2(15.57,11.47) v2(17.33,15) v2(17.33,13.23) v2(17.33,11.47) v2(17.6,6.9) v2(17.6,3.9) v2(18.35,8.4) v2(18.35,5.4) v2(18.35,2.4) v2(19.1,9.9) v2(19.1,6.9) v2(19.1,3.9) v2(19.1,0.9) v2(19.85,5.4) v2(20.6,9.9) v2(20.6,0.9) v2(21.35,5.4) v2(22.1,9.9) v2(22.1,0.9) v2(22.85,5.4) v2(23.6,9.9) v2(23.6,0.9) v2(24.35,5.4) v2(25.1,9.9) v2(25.1,6.9) v2(25.1,3.9) v2(25.1,0.9) v2(25.85,8.4) v2(25.85,5.4) v2(25.85,2.4) v2(26.6,9.9) v2(26.6,6.9) v2(26.6,3.9) v2(26.6,0.9) v2(27.35,5.4) v2(28.1,9.9) v2(28.1,0.9) v2(28.85,5.4) v2(29.6,9.9) v2(29.6,0.9) v2(30.35,5.4) v2(31.1,9.9) v2(31.1,0.9) v2(31.85,5.4) v2(32.6,9.9) v2(32.6,6.9) v2(32.6,3.9) v2(33.35,8.4) v2(33.35,5.4) v2(33.35,2.4) v2(34.1,6.9) v2(34.1,3.9) v2(34.37,15) v2(34.37,13.23) v2(34.37,11.47) v2(36.14,15) v2(36.14,13.23) v2(36.14,11.47) v2(37.91,18.54) v2(37.91,16.77) v2(39.68,18.54) v2(39.68,16.77) v2(39.68,15) v2(39.68,13.23) v2(39.68,11.47) v2(39.68,9.7) v2(41.45,18.54) v2(41.45,16.77) v2(41.45,15) v2(41.45,13.23) v2(41.45,11.47) v2(41.45,9.7) v2(43.22,18.54) v2(43.22,16.77) v2(43.22,15) v2(43.22,13.23) v2(43.22,11.47) v2(43.22,9.7) v2(44.98,18.54) v2(55,18.54) v2(56.77,18.54) v2(56.77,16.77) v2(56.77,15) v2(56.77,13.23) v2(56.77,11.47) v2(56.77,9.7) v2(58.54,18.54) v2(58.54,16.77) v2(58.54,15) v2(58.54,13.23) v2(58.54,11.47) v2(58.54,9.7) v2(60.3,18.54) v2(60.3,16.77) v2(60.3,15) v2(60.3,13.23) v2(60.3,11.47) v2(60.3,9.7) v2(62.07,18.54) v2(62.07,16.77) v2(63.84,15) v2(63.84,13.23) v2(63.84,11.47) v2(65.61,15) v2(65.61,13.23) v2(65.61,11.47) v2(82.65,15) v2(82.65,13.23) v2(82.65,11.47) v2(84.42,15) v2(84.42,13.23) v2(84.42,11.47) v2(86.19,18.54) v2(86.19,16.77) v2(87.95,18.54) v2(87.95,16.77) v2(87.95,15) v2(87.95,13.23) v2(87.95,11.47) v2(87.95,9.7) v2(89.72,18.54) v2(89.72,16.77) v2(89.72,15) v2(89.72,13.23) v2(89.72,11.47) v2(89.72,9.7) v2(91.49,18.54) v2(91.49,16.77) v2(91.49,15) v2(91.49,13.23) v2(91.49,11.47) v2(91.49,9.7) v2(93.26,18.54)
$1N6081: length 4.2
  Top Layer w0.25: U1.11 23.6,60.85
  Top Layer w0.5: D2.2 23.6,57.85 C13.2 23.6,60.85
$1N6213: length 5
  Top Layer w0.25: 22.13,62.42 22.32,62.61 U1.9
  Top Layer w0.5: R3.1 20.85,61.14 22.13,62.42
$1N6253: length 6.3
  Top Layer w0.25: 22.12,63.11 U1.8
  Top Layer w0.5: R4.1 19.53,60.83 21.81,63.11 22.12,63.11
$1N6292: length 13.3
  Top Layer w0.5: v2(10.41,52.22) Q2.1
  Bottom Layer w0.5: v2(10.41,52.22) 10.41,52.65 13.85,56.1 19.3,56.1 v2(19.53,56.33) v2(20.85,56.33)
$1N7708: length 20.1
  Top Layer w0.5: v2(12.88,52.86) 12.88,51.96
  Bottom Layer w0.5: v2(12.88,52.86) 12.88,53.43 13.52,54.07 22.27,54.07 24.35,56.15 v3(24.35,60.74) v3(24.35,62.16)
$1N8083: length 4.4
  Top Layer w0.25: R8.1 C30.2 20.98,65.73 22.1,64.61 U1.5
$1N8088: length 4.9
  Top Layer w0.25: R7.1 C30.1 21.46,66.34 21.46,66.05 22.4,65.11 U1.4
$1N9456: length 72.6
  Top Layer w0.25: v1(30.91,17.41) U3.2 ; R6.2 v1(35.15,67.13)
  Bottom Layer w0.25: v1(35.15,67.13) 35.68,66.6 38.49,66.6 40.34,64.75 45.44,64.75 46.25,63.95 46.25,54.25 46.77,53.72 48.74,53.72 49.58,52.88 49.58,36.85 30.91,18.19 v1(30.91,17.41)
$1N9460: length 4.4
  Top Layer w0.25: U1.26 29.61,64.61 30.72,65.73 C29.2 R5.1
$1N9467: length 4.9
  Top Layer w0.25: R6.1 C29.1 30.25,66.34 30.25,66.05 29.31,65.11 U1.27
$1N9476: length 24.1
  Top Layer w0.5: 28.76,61.95 28.76,60.92 29.5,60.18 C12.1 v2(29.5,56.33)
  Bottom Layer w0.5: v2(29.5,56.33) 30.35,55.48 38.52,55.48 40.7,53.3 40.7,50.8 39.41,49.51 38.06,49.51
  vias: v1(34.94,50.01) v1(34.94,49.35) v1(34.94,48.68) v1(34.94,48.02) v1(34.94,47.36) v1(34.94,46.7) v1(34.94,46.04) v1(35.6,50.01) v1(35.6,49.35) v1(35.6,48.68) v1(35.6,48.02) v1(35.6,47.36) v1(35.6,46.7) v1(35.6,46.04) v1(36.26,50.01) v1(36.26,49.35) v1(36.26,48.68) v1(36.26,48.02) v1(36.26,47.36) v1(36.26,46.7) v1(36.26,46.04) v1(36.92,50.01) v1(36.92,49.35) v1(36.92,48.68) v1(36.92,48.02) v1(36.92,47.36) v1(36.92,46.7) v1(36.92,46.04) v1(37.58,50.01) v1(37.58,49.35) v1(37.58,48.68) v1(37.58,48.02) v1(37.58,47.36) v1(37.58,46.7) v1(37.58,46.04) v1(38.25,50.01) v1(38.25,49.35) v1(38.25,48.68) v1(38.25,48.02) v1(38.25,47.36) v1(38.25,46.7) v1(38.25,46.04) v1(38.91,50.01) v1(38.91,49.35) v1(38.91,48.68) v1(38.91,48.02) v1(38.91,47.36) v1(38.91,46.7) v1(38.91,46.04) v2(27.36,45.3) v2(27.36,43.6) v2(27.36,41.89) v2(27.36,40.19) v2(27.36,38.48) v2(29.13,45.3) v2(29.13,38.48) v2(30.9,45.3) v2(30.9,38.48) v2(32.67,45.3) v2(32.67,38.48) v2(34.44,45.3) v2(34.44,38.48) v2(36.21,45.3) v2(36.21,38.48) v2(37.97,45.3) v2(37.97,38.48) v2(39.74,45.3) v2(39.74,38.48) v2(41.51,45.3) v2(41.51,38.48) v2(43.28,45.3) v2(43.28,38.48) v2(45.05,45.3) v2(45.05,38.48) v2(46.82,45.3) v2(46.82,43.6) v2(46.82,41.89) v2(46.82,40.19) v2(46.82,38.48)
$1N9481: length 15.3
  Top Layer w0.5: v2(34.22,51.96) Q3.1
  Bottom Layer w0.5: v3(27.35,62.16) v3(27.35,60.74) 27.35,56.29 31.68,51.96 v2(34.22,51.96)
$1N9486: length 19.2
  Top Layer w0.5: v2(41.3,46.71) Q1.1
  Bottom Layer w0.5: v2(30.85,56.33) v2(32.18,56.33) 32.41,56.1 38.75,56.1 41.3,53.55 v2(41.3,46.71)
$1N9487: length 6.1
  Top Layer w0.25: 29.59,63.11 U1.23
  Top Layer w0.5: 29.59,63.11 29.9,63.11 32.18,60.83 32.18,59.09
$1N9488: length 4.8
  Top Layer w0.25: 29.58,62.42 29.39,62.61 U1.22
  Top Layer w0.5: 30.85,59.09 30.85,61.14 29.58,62.42
$1N9489: length 4.2
  Top Layer w0.25: U1.20 28.1,60.85
  Top Layer w0.5: D1.2 28.1,57.85 C12.2 28.1,60.85
$1N12644: length 3.8
  Top Layer w0.25: U1.32 27.6,68.8 27.35,69.05 26.65,69.05 26.32,69.39 C31.2
$1N12652: length 5.4
  Top Layer w0.25: 21.64,70.02 21.64,69.46 22.1,69 23.1,69 23.65,68.45 24.65,68.45 25.1,68 U1.37
$1N20860:
  vias: v2(35.1,88.6) v2(35.1,85.6) v2(35.85,90.1) v2(35.85,87.1) v2(35.85,84.1) v2(36.6,88.6) v2(37.35,90.1) v2(37.35,87.1) v2(37.35,84.1) v2(38.1,88.6) v2(38.85,90.1) v2(38.85,87.1) v2(38.85,84.1) v2(39.6,88.6) v2(40.35,90.1) v2(40.35,87.1) v2(40.35,84.1) v2(41.1,88.6) v2(41.1,85.6) v2(41.85,90.1) v2(41.85,87.1) v2(41.85,84.1) v2(42.6,88.6) v2(42.6,85.6) v2(43.35,90.1) v2(43.35,87.1) v2(43.35,84.1) v2(44.1,91.6) v2(44.1,85.6) v2(44.85,84.1) v2(45.6,91.6) v2(45.6,85.6) v2(46.35,84.1) v2(47.1,91.6) v2(47.1,85.6) v2(47.85,84.1) v2(48.6,91.6) v2(48.6,85.6) v2(49.35,84.1) v2(50.1,91.6) v2(50.1,85.6) v2(50.85,84.1) v2(51.6,91.6) v2(51.6,85.6) v2(52.35,84.1) v2(53.1,91.6) v2(53.1,85.6) v2(53.85,84.1) v2(54.6,91.6) v2(54.6,85.6) v2(55.35,84.1) v2(56.1,85.6) v2(56.85,90.1) v2(56.85,87.1) v2(56.85,84.1) v2(57.6,88.6) v2(57.6,85.6) v2(58.35,90.1) v2(58.35,87.1) v2(58.35,84.1) v2(59.1,88.6) v2(59.1,85.6) v2(59.85,90.1) v2(59.85,87.1) v2(59.85,84.1) v2(60.6,88.6) v2(60.6,85.6) v2(61.35,90.1) v2(61.35,87.1) v2(61.35,84.1) v2(62.1,88.6) v2(62.1,85.6) v2(62.85,90.1) v2(62.85,87.1) v2(62.85,84.1) v2(64.35,90.1) v2(64.35,84.1) v2(65.1,88.6) v2(65.1,85.6)
$1N28880: length 75.2
  Top Layer w0.25: R7.2 v1(16.56,67.13) ; v1(20.79,17.41) U4.1
  Bottom Layer w0.25: v1(20.79,17.41) 20.79,18.11 0.85,38.06 0.85,63.95 3.5,66.6 16.03,66.6 v1(16.56,67.13)
$1N28888: length 23.1
  Top Layer w0.5: 22.2,56.31 C13.1 22.2,60.18 22.95,60.92 22.95,61.95
  Bottom Layer w0.5: 13.64,49.51 12.09,49.51 11.7,49.9 11.7,53.1 14.08,55.48 21.35,55.48 v2(22.2,56.33)
  vias: v1(12.8,50.01) v1(12.8,49.35) v1(12.8,48.68) v1(12.8,48.02) v1(12.8,47.36) v1(12.8,46.7) v1(12.8,46.04) v1(13.46,50.01) v1(13.46,49.35) v1(13.46,48.68) v1(13.46,48.02) v1(13.46,47.36) v1(13.46,46.7) v1(13.46,46.04) v1(14.12,50.01) v1(14.12,49.35) v1(14.12,48.68) v1(14.12,48.02) v1(14.12,47.36) v1(14.12,46.7) v1(14.12,46.04) v1(14.79,50.01) v1(14.79,49.35) v1(14.79,48.68) v1(14.79,48.02) v1(14.79,47.36) v1(14.79,46.7) v1(14.79,46.04) v1(15.45,50.01) v1(15.45,49.35) v1(15.45,48.68) v1(15.45,48.02) v1(15.45,47.36) v1(15.45,46.7) v1(15.45,46.04) v1(16.11,50.01) v1(16.11,49.35) v1(16.11,48.68) v1(16.11,48.02) v1(16.11,47.36) v1(16.11,46.7) v1(16.11,46.04) v1(16.77,50.01) v1(16.77,49.35) v1(16.77,48.68) v1(16.77,48.02) v1(16.77,47.36) v1(16.77,46.7) v1(16.77,46.04) v2(4.89,45.3) v2(4.89,43.6) v2(4.89,41.89) v2(4.89,40.19) v2(4.89,38.48) v2(6.66,45.3) v2(6.66,38.48) v2(8.43,45.3) v2(8.43,38.48) v2(10.2,45.3) v2(10.2,38.48) v2(11.97,45.3) v2(11.97,38.48) v2(13.73,45.3) v2(13.73,38.48) v2(15.5,45.3) v2(15.5,38.48) v2(17.27,45.3) v2(17.27,38.48) v2(19.04,45.3) v2(19.04,38.48) v2(20.81,45.3) v2(20.81,38.48) v2(22.58,45.3) v2(22.58,38.48) v2(24.34,45.3) v2(24.34,43.6) v2(24.34,41.89) v2(24.34,40.19) v2(24.34,38.48)
$1N41051: length 6.3
  Top Layer w1: v2(73,83.37) 73,81.1 72,80.1 D9.1
  vias: v2(59.5,92.37) v2(60.25,96.87) v2(60.25,93.87) v2(61,95.37) v2(62.5,95.37) v2(64,95.37) v2(65.5,95.37) v2(66.25,96.87) v2(66.25,93.87) v2(67,98.37) v2(67,95.37) v2(67,92.37) v2(67.75,96.87) v2(67.75,93.87) v2(67.75,90.87) v2(68.5,95.37) v2(69.25,90.87) v2(69.25,84.87) v2(70,95.37) v2(70,89.37) v2(70,83.37) v2(70.75,90.87) v2(70.75,84.87) v2(71.5,95.37) v2(71.5,89.37) v2(71.5,86.37) v2(71.5,83.37) v2(72.25,90.87) v2(72.25,87.87) v2(72.25,84.87) v2(73,95.37) v2(73,89.37) v2(73,86.37) v2(73.75,96.87) v2(73.75,93.87) v2(73.75,90.87) v2(73.75,87.87) v2(73.75,84.87) v2(74.5,98.37) v2(74.5,95.37) v2(74.5,92.37) v2(74.5,89.37) v2(74.5,86.37) v2(74.5,83.37) v2(75.25,96.87) v2(75.25,93.87) v2(75.25,90.87) v2(75.25,87.87) v2(75.25,84.87) v2(76,98.37) v2(76,95.37) v2(76,92.37) v2(76,89.37) v2(76,86.37) v2(76,83.37)
$1N44338: length 4.2
  Top Layer w0.25: 71.88,60.85 U8.11
  Top Layer w0.5: 71.88,60.85 C44.2 71.88,57.85 D6.2
$1N44340: length 5
  Top Layer w0.25: U8.9 70.59,62.61 70.4,62.42
  Top Layer w0.5: R12.1 69.13,61.14 70.4,62.42
$1N44341: length 6.3
  Top Layer w0.25: 70.4,63.11 U8.8
  Top Layer w0.5: 70.4,63.11 70.09,63.11 67.81,60.83 R13.1
$1N44342: length 22.9
  Top Layer w0.5: 71.22,61.95 71.22,60.92 70.48,60.18 C44.1 70.48,56.53
  Bottom Layer w0.5: 70.48,56.35 69.61,55.48 62.34,55.48 59.98,53.12 59.98,49.92 60.37,49.53 61.92,49.53
  vias: v1(61.08,50.01) v1(61.08,49.35) v1(61.08,48.68) v1(61.08,48.02) v1(61.08,47.36) v1(61.08,46.7) v1(61.08,46.04) v1(61.74,50.01) v1(61.74,49.35) v1(61.74,48.68) v1(61.74,48.02) v1(61.74,47.36) v1(61.74,46.7) v1(61.74,46.04) v1(62.4,50.01) v1(62.4,49.35) v1(62.4,48.68) v1(62.4,48.02) v1(62.4,47.36) v1(62.4,46.7) v1(62.4,46.04) v1(63.06,50.01) v1(63.06,49.35) v1(63.06,48.68) v1(63.06,48.02) v1(63.06,47.36) v1(63.06,46.7) v1(63.06,46.04) v1(63.72,50.01) v1(63.72,49.35) v1(63.72,48.68) v1(63.72,48.02) v1(63.72,47.36) v1(63.72,46.7) v1(63.72,46.04) v1(64.39,50.01) v1(64.39,49.35) v1(64.39,48.68) v1(64.39,48.02) v1(64.39,47.36) v1(64.39,46.7) v1(64.39,46.04) v1(65.05,50.01) v1(65.05,49.35) v1(65.05,48.68) v1(65.05,48.02) v1(65.05,47.36) v1(65.05,46.7) v1(65.05,46.04) v2(53.17,45.3) v2(53.17,43.6) v2(53.17,41.89) v2(53.17,40.19) v2(53.17,38.48) v2(54.94,45.3) v2(54.94,38.48) v2(56.7,45.3) v2(56.7,38.48) v2(58.47,45.3) v2(58.47,38.48) v2(60.24,45.3) v2(60.24,38.48) v2(62.01,45.3) v2(62.01,38.48) v2(63.78,45.3) v2(63.78,38.48) v2(65.55,45.3) v2(65.55,38.48) v2(67.31,45.3) v2(67.31,38.48) v2(69.08,45.3) v2(69.08,38.48) v2(70.48,56.33) v2(70.85,45.3) v2(70.85,38.48) v2(72.62,45.3) v2(72.62,43.6) v2(72.62,41.89) v2(72.62,40.19) v2(72.62,38.48)
$1N44343: length 13.3
  Top Layer w0.5: v2(58.68,52.22) 58.68,51.32
  Bottom Layer w0.5: 58.68,52.24 58.68,52.68 62.13,56.12 67.58,56.12 67.81,56.35 ; v2(67.81,56.33) v2(69.13,56.33)
$1N44347: length 20.1
  Top Layer w0.5: 61.16,51.96 v2(61.16,52.86)
  Bottom Layer w0.5: v3(72.63,62.16) v3(72.63,60.74) 72.63,56.17 70.55,54.09 61.8,54.09 61.16,53.45 61.16,52.88
$1N44348: length 4.4
  Top Layer w0.25: R17.1 C61.2 69.26,65.73 70.38,64.61 U8.5
$1N44349: length 4.9
  Top Layer w0.25: U8.4 70.68,65.11 69.73,66.05 69.73,66.34 C61.1 R16.1
$1N44352: length 4.2
  Top Layer w0.25: U8.20 76.38,60.85
  Top Layer w0.5: 76.38,60.85 C43.2 76.38,57.85 D5.2
$1N44353: length 5
  Top Layer w0.25: 77.86,62.42 77.67,62.61 U8.22
  Top Layer w0.5: R10.2 79.13,61.14 77.86,62.42
$1N44354: length 6.3
  Top Layer w0.25: U8.23 77.86,63.11
  Top Layer w0.5: R11.2 80.45,60.83 78.17,63.11 77.86,63.11
$1N44355: length 19.3
  Top Layer w0.5: v2(89.58,46.71) Q5.1
  Bottom Layer w0.5: v2(89.58,46.71) 89.58,53.57 87.02,56.12 80.68,56.12 80.45,56.35 ; v2(80.45,56.33) v2(79.13,56.33)
$1N44358: length 75.2
  Top Layer w0.25: R15.2 v1(83.43,67.13) ; v1(79.19,17.41) U9.2
  Bottom Layer w0.25: v1(79.19,17.41) 79.19,18.11 99.13,38.06 99.13,63.95 96.48,66.6 83.95,66.6 v1(83.43,67.13)
$1N44361: length 15.3
  Top Layer w0.5: v2(82.49,51.96) Q7.1
  Bottom Layer w0.5: v3(75.63,62.16) v3(75.63,60.74) 75.63,56.29 79.96,51.96 v2(82.49,51.96)
$1N44363: length 4.4
  Top Layer w0.25: U8.26 77.88,64.61 79,65.73 C60.2 R14.1
$1N44364: length 4.9
  Top Layer w0.25: R15.1 C60.1 78.53,66.34 78.53,66.05 77.58,65.11 U8.27
$1N44365: length 23.9
  Top Layer w0.5: 77.78,56.53 C43.1 77.78,60.18 77.04,60.92 77.04,61.95
  Bottom Layer w0.5: 86.34,49.53 87.68,49.53 88.98,50.82 88.98,53.32 86.82,55.48 78.65,55.48 77.78,56.35
  vias: v1(83.21,50.01) v1(83.21,49.35) v1(83.21,48.68) v1(83.21,48.02) v1(83.21,47.36) v1(83.21,46.7) v1(83.21,46.04) v1(83.87,50.01) v1(83.87,49.35) v1(83.87,48.68) v1(83.87,48.02) v1(83.87,47.36) v1(83.87,46.7) v1(83.87,46.04) v1(84.54,50.01) v1(84.54,49.35) v1(84.54,48.68) v1(84.54,48.02) v1(84.54,47.36) v1(84.54,46.7) v1(84.54,46.04) v1(85.2,50.01) v1(85.2,49.35) v1(85.2,48.68) v1(85.2,48.02) v1(85.2,47.36) v1(85.2,46.7) v1(85.2,46.04) v1(85.86,50.01) v1(85.86,49.35) v1(85.86,48.68) v1(85.86,48.02) v1(85.86,47.36) v1(85.86,46.7) v1(85.86,46.04) v1(86.52,50.01) v1(86.52,49.35) v1(86.52,48.68) v1(86.52,48.02) v1(86.52,47.36) v1(86.52,46.7) v1(86.52,46.04) v1(87.18,50.01) v1(87.18,49.35) v1(87.18,48.68) v1(87.18,48.02) v1(87.18,47.36) v1(87.18,46.7) v1(87.18,46.04) v2(75.64,45.3) v2(75.64,43.6) v2(75.64,41.89) v2(75.64,40.19) v2(75.64,38.48) v2(77.41,45.3) v2(77.41,38.48) v2(77.78,56.33) v2(79.18,45.3) v2(79.18,38.48) v2(80.94,45.3) v2(80.94,38.48) v2(82.71,45.3) v2(82.71,38.48) v2(84.48,45.3) v2(84.48,38.48) v2(86.25,45.3) v2(86.25,38.48) v2(88.02,45.3) v2(88.02,38.48) v2(89.79,45.3) v2(89.79,38.48) v2(91.56,45.3) v2(91.56,38.48) v2(93.32,45.3) v2(93.32,38.48) v2(95.09,45.3) v2(95.09,43.6) v2(95.09,41.89) v2(95.09,40.19) v2(95.09,38.48)
$1N44377: length 3.3
  Top Layer w0.25: U8.32 75.88,68.79 C62.2
$1N44378: length 3.7
  Top Layer w0.25: 71.21,70.02 73.38,67.85 U8.37
$1N44386: length 88.5
  Top Layer w0.25: R16.2 v1(64.83,67.13) ; v1(69.07,17.41) U10.1
  Bottom Layer w0.25: 50.41,36.85 69.07,18.19 v1(69.07,17.41) ; 50.41,36.85 50.41,52.88 51.24,53.72 53.21,53.72 53.73,54.25 53.73,63.95 54.54,64.75 59.64,64.75 61.49,66.6 64.31,66.6 v1(64.83,67.13) ; 50.41,36.85 50.41,52.81
$1N82741: length 1.5
  Top Layer w0.25: R21.1 34.08,70.04 C75.2

## Copper pours and planes (outline as drawn; the poured copper is in the pictures)
AGND1 on Top Layer: 0,100 100,100 100,0 0,0
AGND1 on Bottom Layer: 0,100 100,100 100,0 0,0
AGND1 on Inner1: 0,100 100,100 100,0 0,0
AGND1 on Inner2: 0,100 100,100 100,0 0,0
AGND1 on Inner3: 64.98,10.9 83.27,10.9 83.27,0.3 64.98,0.3
AGND1 on Inner3: 0,100 100,100 100,0 0,0
AGND1 on Inner4: 64.98,10.9 83.27,10.9 83.27,0.3 64.98,0.3
AGND1 on Inner4: 0,100 100,100 100,0 0,0
VIN on Top Layer: 87.59,63.9 95.88,63.9 95.88,46.8 87.59,46.8
VIN on Top Layer: 4.1,63.9 12.39,63.9 12.39,46.8 4.1,46.8
VIN on Top Layer: 52.38,63.9 60.66,63.9 60.66,46.8 52.38,46.8
VIN on Top Layer: 39.32,63.9 47.61,63.9 47.61,46.8 39.32,46.8
VIN on Top Layer: 39.52,65.79 39.52,75.2 60.68,75.2 60.68,65.79
VIN on Bottom Layer: 42.5,52.02 47.25,52.02 47.25,46.8 42.5,46.8
VIN on Bottom Layer: 52.86,51.66 57.36,51.66 57.36,47.16 52.86,47.16
VIN on Bottom Layer: 90.78,52.02 95.52,52.02 95.52,46.8 90.78,46.8
VIN on Bottom Layer: 4.58,51.66 9.08,51.66 9.08,47.16 4.58,47.16
VIN on Inner1: 42.5,52.02 47.25,52.02 47.25,46.8 42.5,46.8
VIN on Inner1: 52.86,51.66 57.36,51.66 57.36,47.16 52.86,47.16
VIN on Inner1: 90.78,52.02 95.52,52.02 95.52,46.8 90.78,46.8
VIN on Inner1: 4.58,51.66 9.08,51.66 9.08,47.16 4.58,47.16
VIN on Inner2: 52.86,51.66 57.36,51.66 57.36,47.16 52.86,47.16
VIN on Inner2: 42.5,52.02 47.25,52.02 47.25,46.8 42.5,46.8
VIN on Inner2: 90.78,52.02 95.52,52.02 95.52,46.8 90.78,46.8
VIN on Inner2: 4.58,51.66 9.08,51.66 9.08,47.16 4.58,47.16
VIN on Inner3: 58.2,75.2 63.36,70.04 63.36,55.6 87.8,55.6 87.8,63.9 97.2,63.9 97.2,33.89 2.78,33.89 2.78,63.9 12.39,63.9 12.39,55.6 36.82,55.6 36.82,70.02 42,75.2
VIN on Inner4: 58.2,75.2 63.36,70.04 63.36,55.6 87.8,55.6 87.8,63.9 97.2,63.9 97.2,36.49 2.78,36.49 2.78,63.9 12.39,63.9 12.39,55.6 36.82,55.6 36.82,70.02 42,75.2
VOUT on Top Layer: 16.7,10.9 34.99,10.9 34.99,0.3 16.7,0.3
VOUT on Top Layer: 31.89,19.6 45.78,19.6 45.78,7.7 31.89,7.7
VOUT on Top Layer: 80.17,19.6 94.06,19.6 94.06,7.7 80.17,7.7
VOUT on Top Layer: 54.2,19.6 68.09,19.6 68.09,7.7 54.2,7.7
VOUT on Top Layer: 5.93,19.6 19.81,19.6 19.81,7.7 5.93,7.7
VOUT on Bottom Layer: 80.17,19.6 94.06,19.6 94.06,7.7 80.17,7.7
VOUT on Bottom Layer: 54.2,19.6 68.09,19.6 68.09,7.7 54.2,7.7
VOUT on Bottom Layer: 16.7,10.9 34.99,10.9 34.99,0.3 16.7,0.3
VOUT on Bottom Layer: 5.93,19.6 19.81,19.6 19.81,7.7 5.93,7.7
VOUT on Bottom Layer: 31.89,19.6 45.78,19.6 45.78,7.7 31.89,7.7
VOUT on Inner1: 16.7,10.9 34.99,10.9 34.99,0.3 16.7,0.3
VOUT on Inner2: 16.7,10.9 34.99,10.9 34.99,0.3 16.7,0.3
VOUT on Inner3: 5.9,19.6 94.06,19.6 94.06,0 5.9,0
VOUT on Inner4: 5.9,19.6 94.06,19.6 94.06,0 5.9,0
$1N6292 on Top Layer: 19.13,57.83 21.25,57.83 21.25,56.03 19.13,56.03
$1N7708 on Top Layer: 24.05,62.51 24.65,62.51 24.65,60.39 24.05,60.39
$1N9456 on Top Layer: 26.93,34.1 48.93,34.1 48.93,15.6 26.93,15.6
$1N9476 on Inner1: 34.67,50.61 39.17,50.61 39.17,46.11 34.67,46.11
$1N9476 on Inner2: 34.67,50.61 39.17,50.61 39.17,46.11 34.67,46.11
$1N9476 on Inner3: 34.67,50.61 39.17,50.61 39.17,46.11 34.67,46.11
$1N9476 on Inner4: 34.67,50.61 39.17,50.61 39.17,46.11 34.67,46.11
$1N9481 on Top Layer: 27.05,62.51 27.65,62.51 27.65,60.39 27.05,60.39
$1N9486 on Top Layer: 30.45,57.83 32.58,57.83 32.58,56.03 30.45,56.03
$1N20860 on Top Layer: 34.6,93.5 65.6,93.5 65.6,83.3 34.6,83.3
$1N20860 on Bottom Layer: 34.6,93.5 65.6,93.5 65.6,83.3 34.6,83.3
$1N20860 on Inner3: 34.6,93.5 65.6,93.5 65.6,83.3 34.6,83.3
$1N20860 on Inner4: 34.6,93.5 65.6,93.5 65.6,83.3 34.6,83.3
$1N28880 on Top Layer: 2.78,34.1 24.78,34.1 24.78,15.6 2.78,15.6
$1N28888 on Top Layer: 2.78,46.15 2.84,46.29 2.98,46.35 9.69,46.35 9.83,46.41 9.89,46.55 9.89,50.15 9.94,50.29 10.09,50.35 17.19,50.35 17.33,50.29 17.39,50.15 17.39,46.5 17.44,46.36 17.59,46.3 24.58,46.3 24.72,46.24 24.78,46.1 24.78,38.2 24.72,38.06 24.58,38 2.98,38 2.84,38.06 2.78,38.2
$1N28888 on Bottom Layer: 2.78,46.15 2.84,46.29 2.98,46.35 9.69,46.35 9.83,46.41 9.89,46.55 9.89,50.15 9.94,50.29 10.09,50.35 17.19,50.35 17.33,50.29 17.39,50.15 17.39,46.5 17.44,46.36 17.59,46.3 24.58,46.3 24.72,46.24 24.78,46.1 24.78,38.2 24.72,38.06 24.58,38 2.98,38 2.84,38.06 2.78,38.2
$1N28888 on Inner1: 12.54,50.61 17.04,50.61 17.04,46.11 12.54,46.11
$1N28888 on Inner2: 12.54,50.61 17.04,50.61 17.04,46.11 12.54,46.11
$1N28888 on Inner3: 12.54,50.61 17.04,50.61 17.04,46.11 12.54,46.11
$1N28888 on Inner4: 12.54,50.61 17.04,50.61 17.04,46.11 12.54,46.11
$1N41051 on Top Layer: 57.27,99.67 76.6,99.67 76.6,82.8 57.27,82.8
$1N41051 on Bottom Layer: 57.27,99.67 76.6,99.67 76.6,82.8 57.27,82.8
$1N41051 on Inner1: 57.27,99.67 76.6,99.67 76.6,82.8 57.27,82.8
$1N41051 on Inner2: 57.27,99.67 76.6,99.67 76.6,82.8 57.27,82.8
$1N41051 on Inner3: 57.27,99.67 76.6,99.67 76.6,82.8 57.27,82.8
$1N41051 on Inner4: 57.27,99.67 76.6,99.67 76.6,82.8 57.27,82.8
$1N44342 on Top Layer: 51.06,46.15 51.12,46.29 51.26,46.35 57.96,46.35 58.1,46.41 58.16,46.55 58.16,50.15 58.22,50.29 58.36,50.35 65.46,50.35 65.6,50.29 65.66,50.15 65.66,46.5 65.72,46.36 65.86,46.3 72.86,46.3 73,46.24 73.06,46.1 73.06,38.2 73,38.06 72.86,38 51.26,38 51.12,38.06 51.06,38.2
$1N44342 on Bottom Layer: 51.06,46.15 51.12,46.29 51.26,46.35 57.96,46.35 58.1,46.41 58.16,46.55 58.16,50.15 58.22,50.29 58.36,50.35 65.46,50.35 65.6,50.29 65.66,50.15 65.66,46.5 65.72,46.36 65.86,46.3 72.86,46.3 73,46.24 73.06,46.1 73.06,38.2 73,38.06 72.86,38 51.26,38 51.12,38.06 51.06,38.2
$1N44342 on Inner1: 60.81,50.61 65.31,50.61 65.31,46.11 60.81,46.11
$1N44342 on Inner2: 60.81,50.61 65.31,50.61 65.31,46.11 60.81,46.11
$1N44342 on Inner3: 60.81,50.61 65.31,50.61 65.31,46.11 60.81,46.11
$1N44342 on Inner4: 60.81,50.61 65.31,50.61 65.31,46.11 60.81,46.11
$1N44343 on Top Layer: 67.41,57.83 69.53,57.83 69.53,56.03 67.41,56.03
$1N44347 on Top Layer: 72.33,62.51 72.93,62.51 72.93,60.39 72.33,60.39
$1N44355 on Top Layer: 78.73,57.83 80.85,57.83 80.85,56.03 78.73,56.03
$1N44358 on Top Layer: 75.2,34.1 97.2,34.1 97.2,15.6 75.2,15.6
$1N44361 on Top Layer: 75.33,62.51 75.93,62.51 75.93,60.39 75.33,60.39
$1N44365 on Inner1: 82.95,50.61 87.45,50.61 87.45,46.11 82.95,46.11
$1N44365 on Inner2: 82.95,50.61 87.45,50.61 87.45,46.11 82.95,46.11
$1N44365 on Inner3: 82.95,50.61 87.45,50.61 87.45,46.11 82.95,46.11
$1N44365 on Inner4: 82.95,50.61 87.45,50.61 87.45,46.11 82.95,46.11
$1N44386 on Top Layer: 51.06,34.1 73.06,34.1 73.06,15.6 51.06,15.6
$1N9476 on Top Layer: 41.82,46.55 41.88,46.41 42.02,46.35 48.73,46.35 48.87,46.29 48.93,46.15 48.93,38.2 48.87,38.06 48.73,38 27.13,38 26.99,38.06 26.93,38.2 26.93,46.1 26.99,46.24 27.13,46.3 34.12,46.3 34.26,46.36 34.32,46.5 34.32,50.15 34.38,50.29 34.52,50.35 39.08,50.35 39.16,50.37 39.22,50.41 40.77,51.95 40.83,52 40.91,52.01 41.62,52.01 41.76,51.95 41.82,51.81
$1N9476 on Bottom Layer: 41.82,46.55 41.88,46.41 42.02,46.35 48.73,46.35 48.87,46.29 48.93,46.15 48.93,38.2 48.87,38.06 48.73,38 27.13,38 26.99,38.06 26.93,38.2 26.93,46.1 26.99,46.24 27.13,46.3 34.12,46.3 34.26,46.36 34.32,46.5 34.32,50.15 34.38,50.29 34.52,50.35 39.08,50.35 39.16,50.37 39.22,50.41 40.77,51.95 40.83,52 40.91,52.01 41.62,52.01 41.76,51.95 41.82,51.81
$1N44365 on Top Layer: 90.1,46.55 90.16,46.41 90.3,46.35 97,46.35 97.14,46.29 97.2,46.15 97.2,38.2 97.14,38.06 97,38 75.4,38 75.26,38.06 75.2,38.2 75.2,46.1 75.26,46.24 75.4,46.3 82.4,46.3 82.54,46.36 82.6,46.5 82.6,50.15 82.66,50.29 82.8,50.35 87.36,50.35 87.43,50.37 87.5,50.41 89.04,51.95 89.11,52 89.18,52.01 89.9,52.01 90.04,51.95 90.1,51.81
$1N44365 on Bottom Layer: 90.1,46.55 90.16,46.41 90.3,46.35 97,46.35 97.14,46.29 97.2,46.15 97.2,38.2 97.14,38.06 97,38 75.4,38 75.26,38.06 75.2,38.2 75.2,46.1 75.26,46.24 75.4,46.3 82.4,46.3 82.54,46.36 82.6,46.5 82.6,50.15 82.66,50.29 82.8,50.35 87.36,50.35 87.43,50.37 87.5,50.41 89.04,51.95 89.11,52 89.18,52.01 89.9,52.01 90.04,51.95 90.1,51.81

## Text on the board
Top Silkscreen Layer: + | -
